# EasyEDA Pro project ProPrj_底板(最终版).epro

# Schematic Schematic1

## Sheets
1 P1: Assembly Variant: Basic; Board Name: Board1; Create Date: 2026-09-26; Page Name: P1; Project Name: 底板; Schematic Name: Schematic1; Update Date: 2026-09-26; Company: 嘉立创EDA; Page Size: A4; Version: V1.0
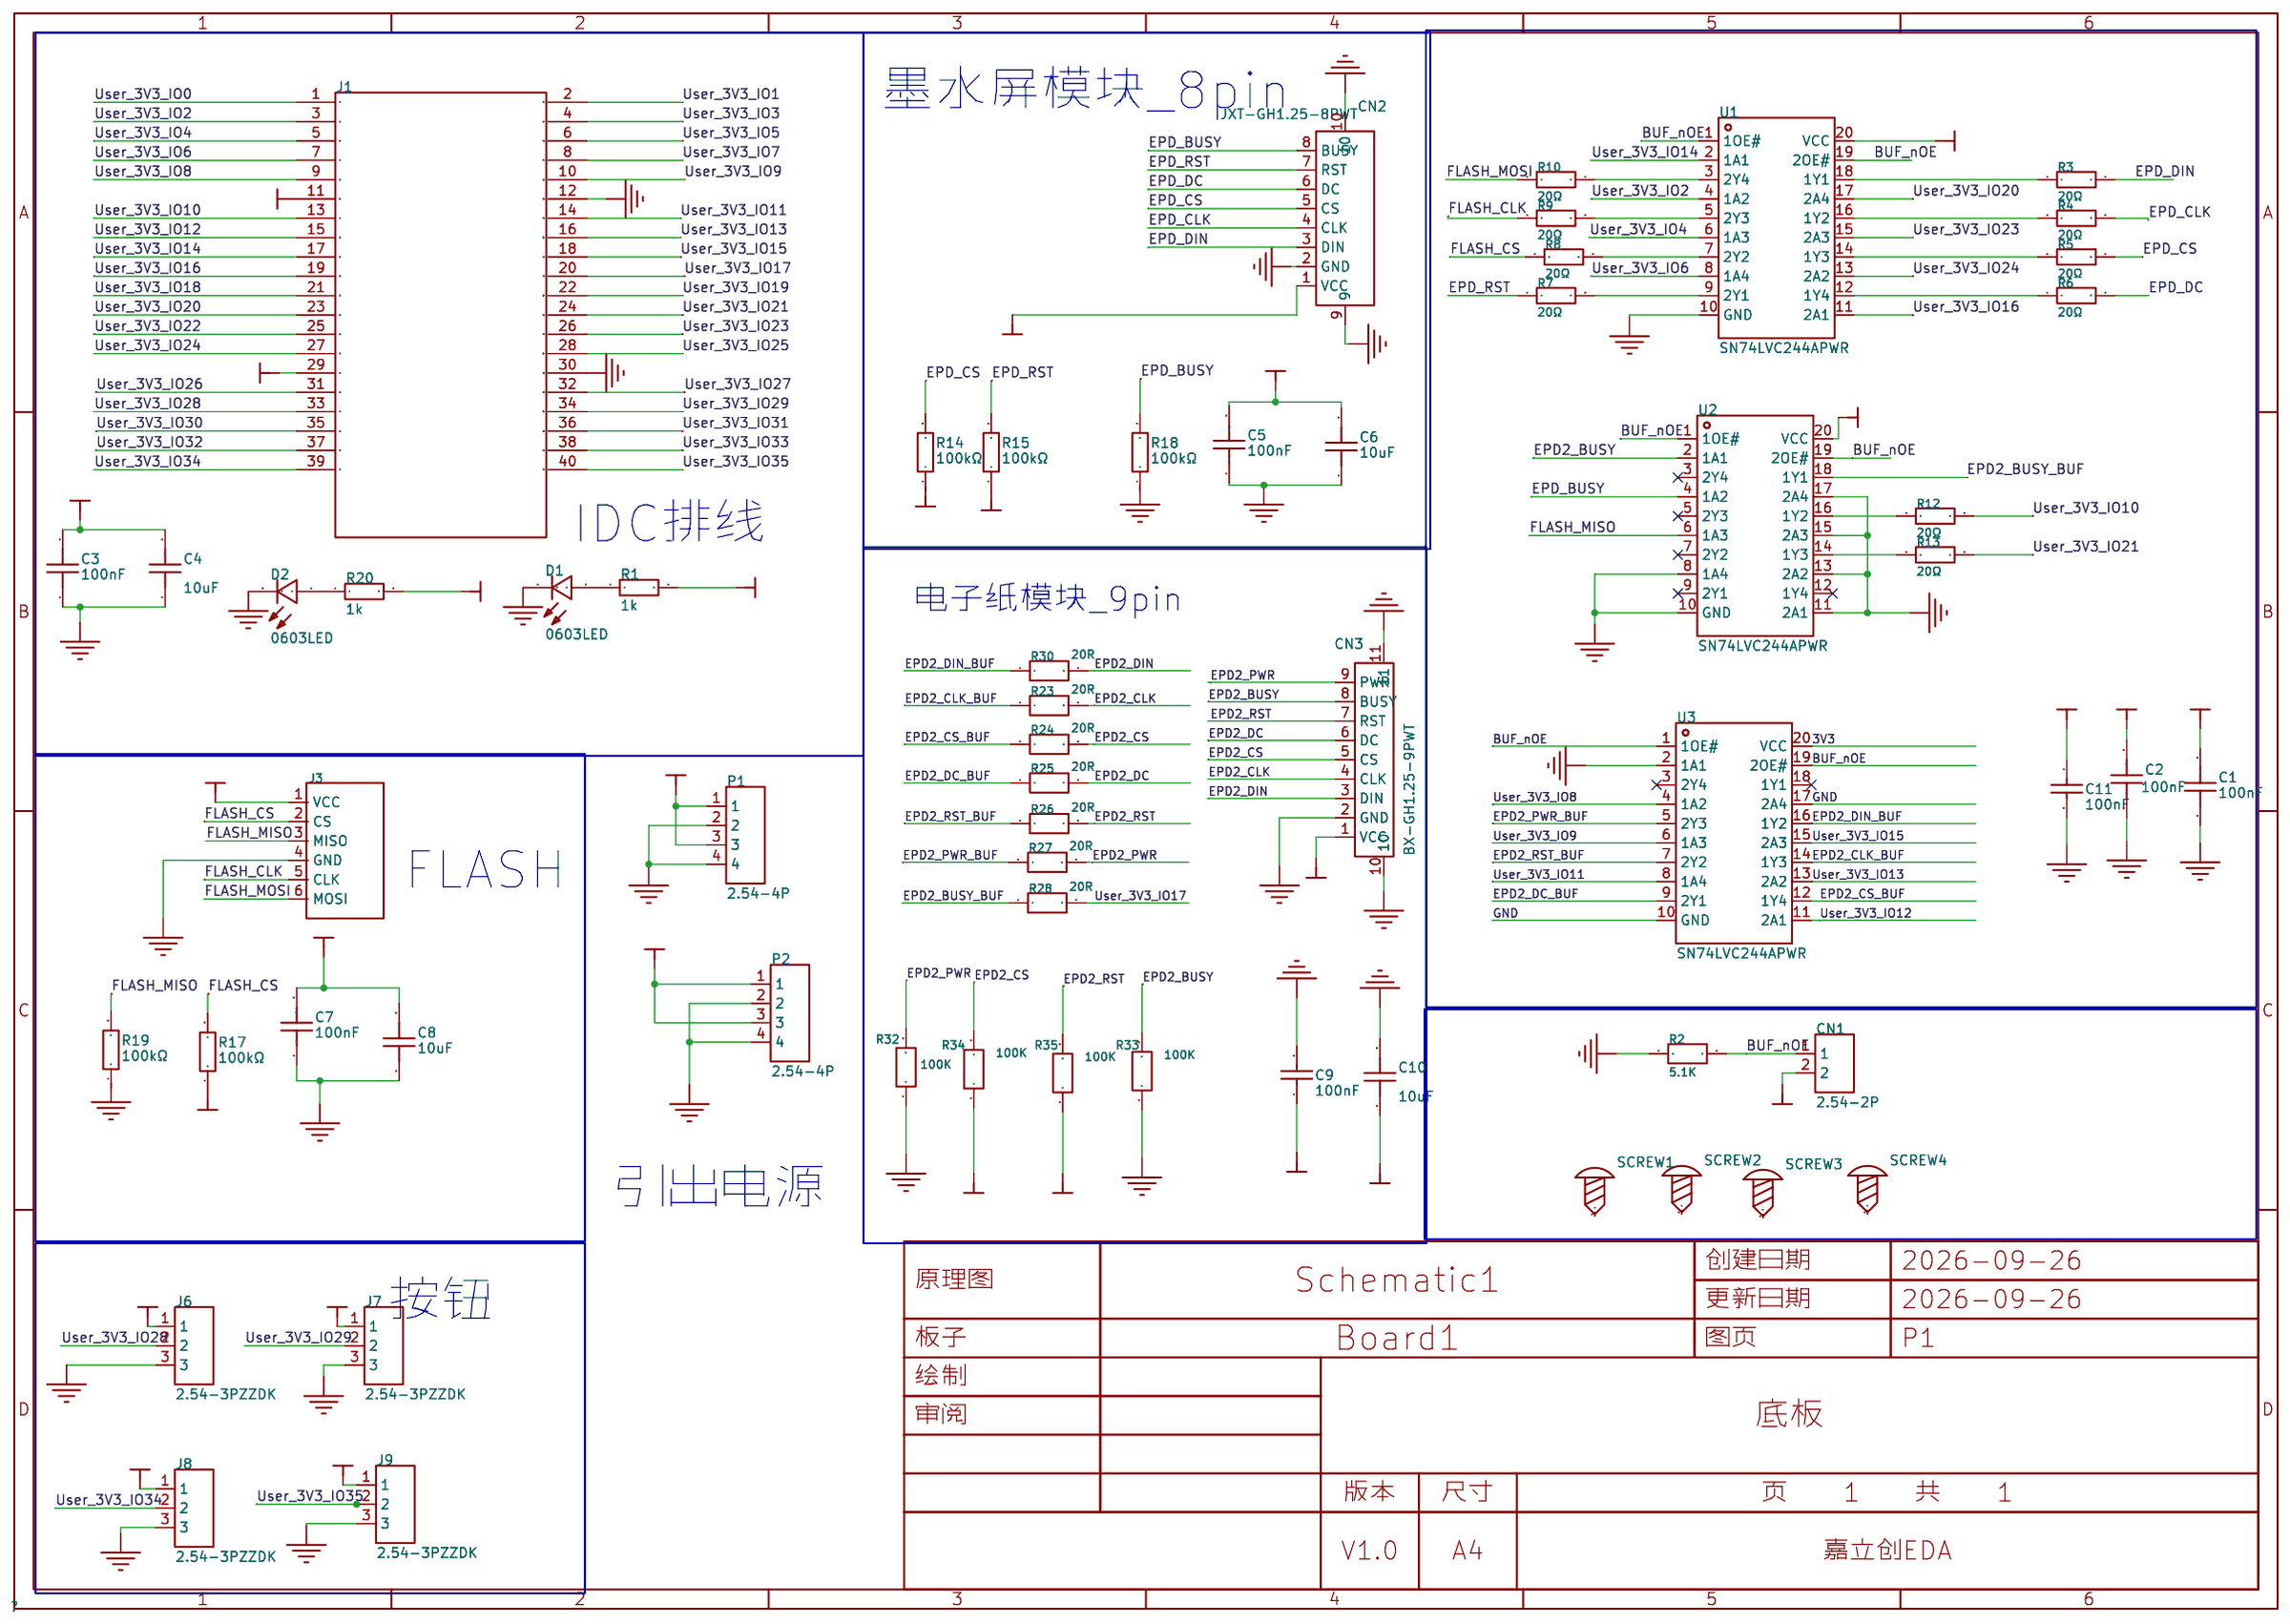
[diagram p0: P1]
2 P2: Create Date: 2026-10-08; Page Name: P2; Project Name: 底板(最终版); Update Date: 2026-10-08
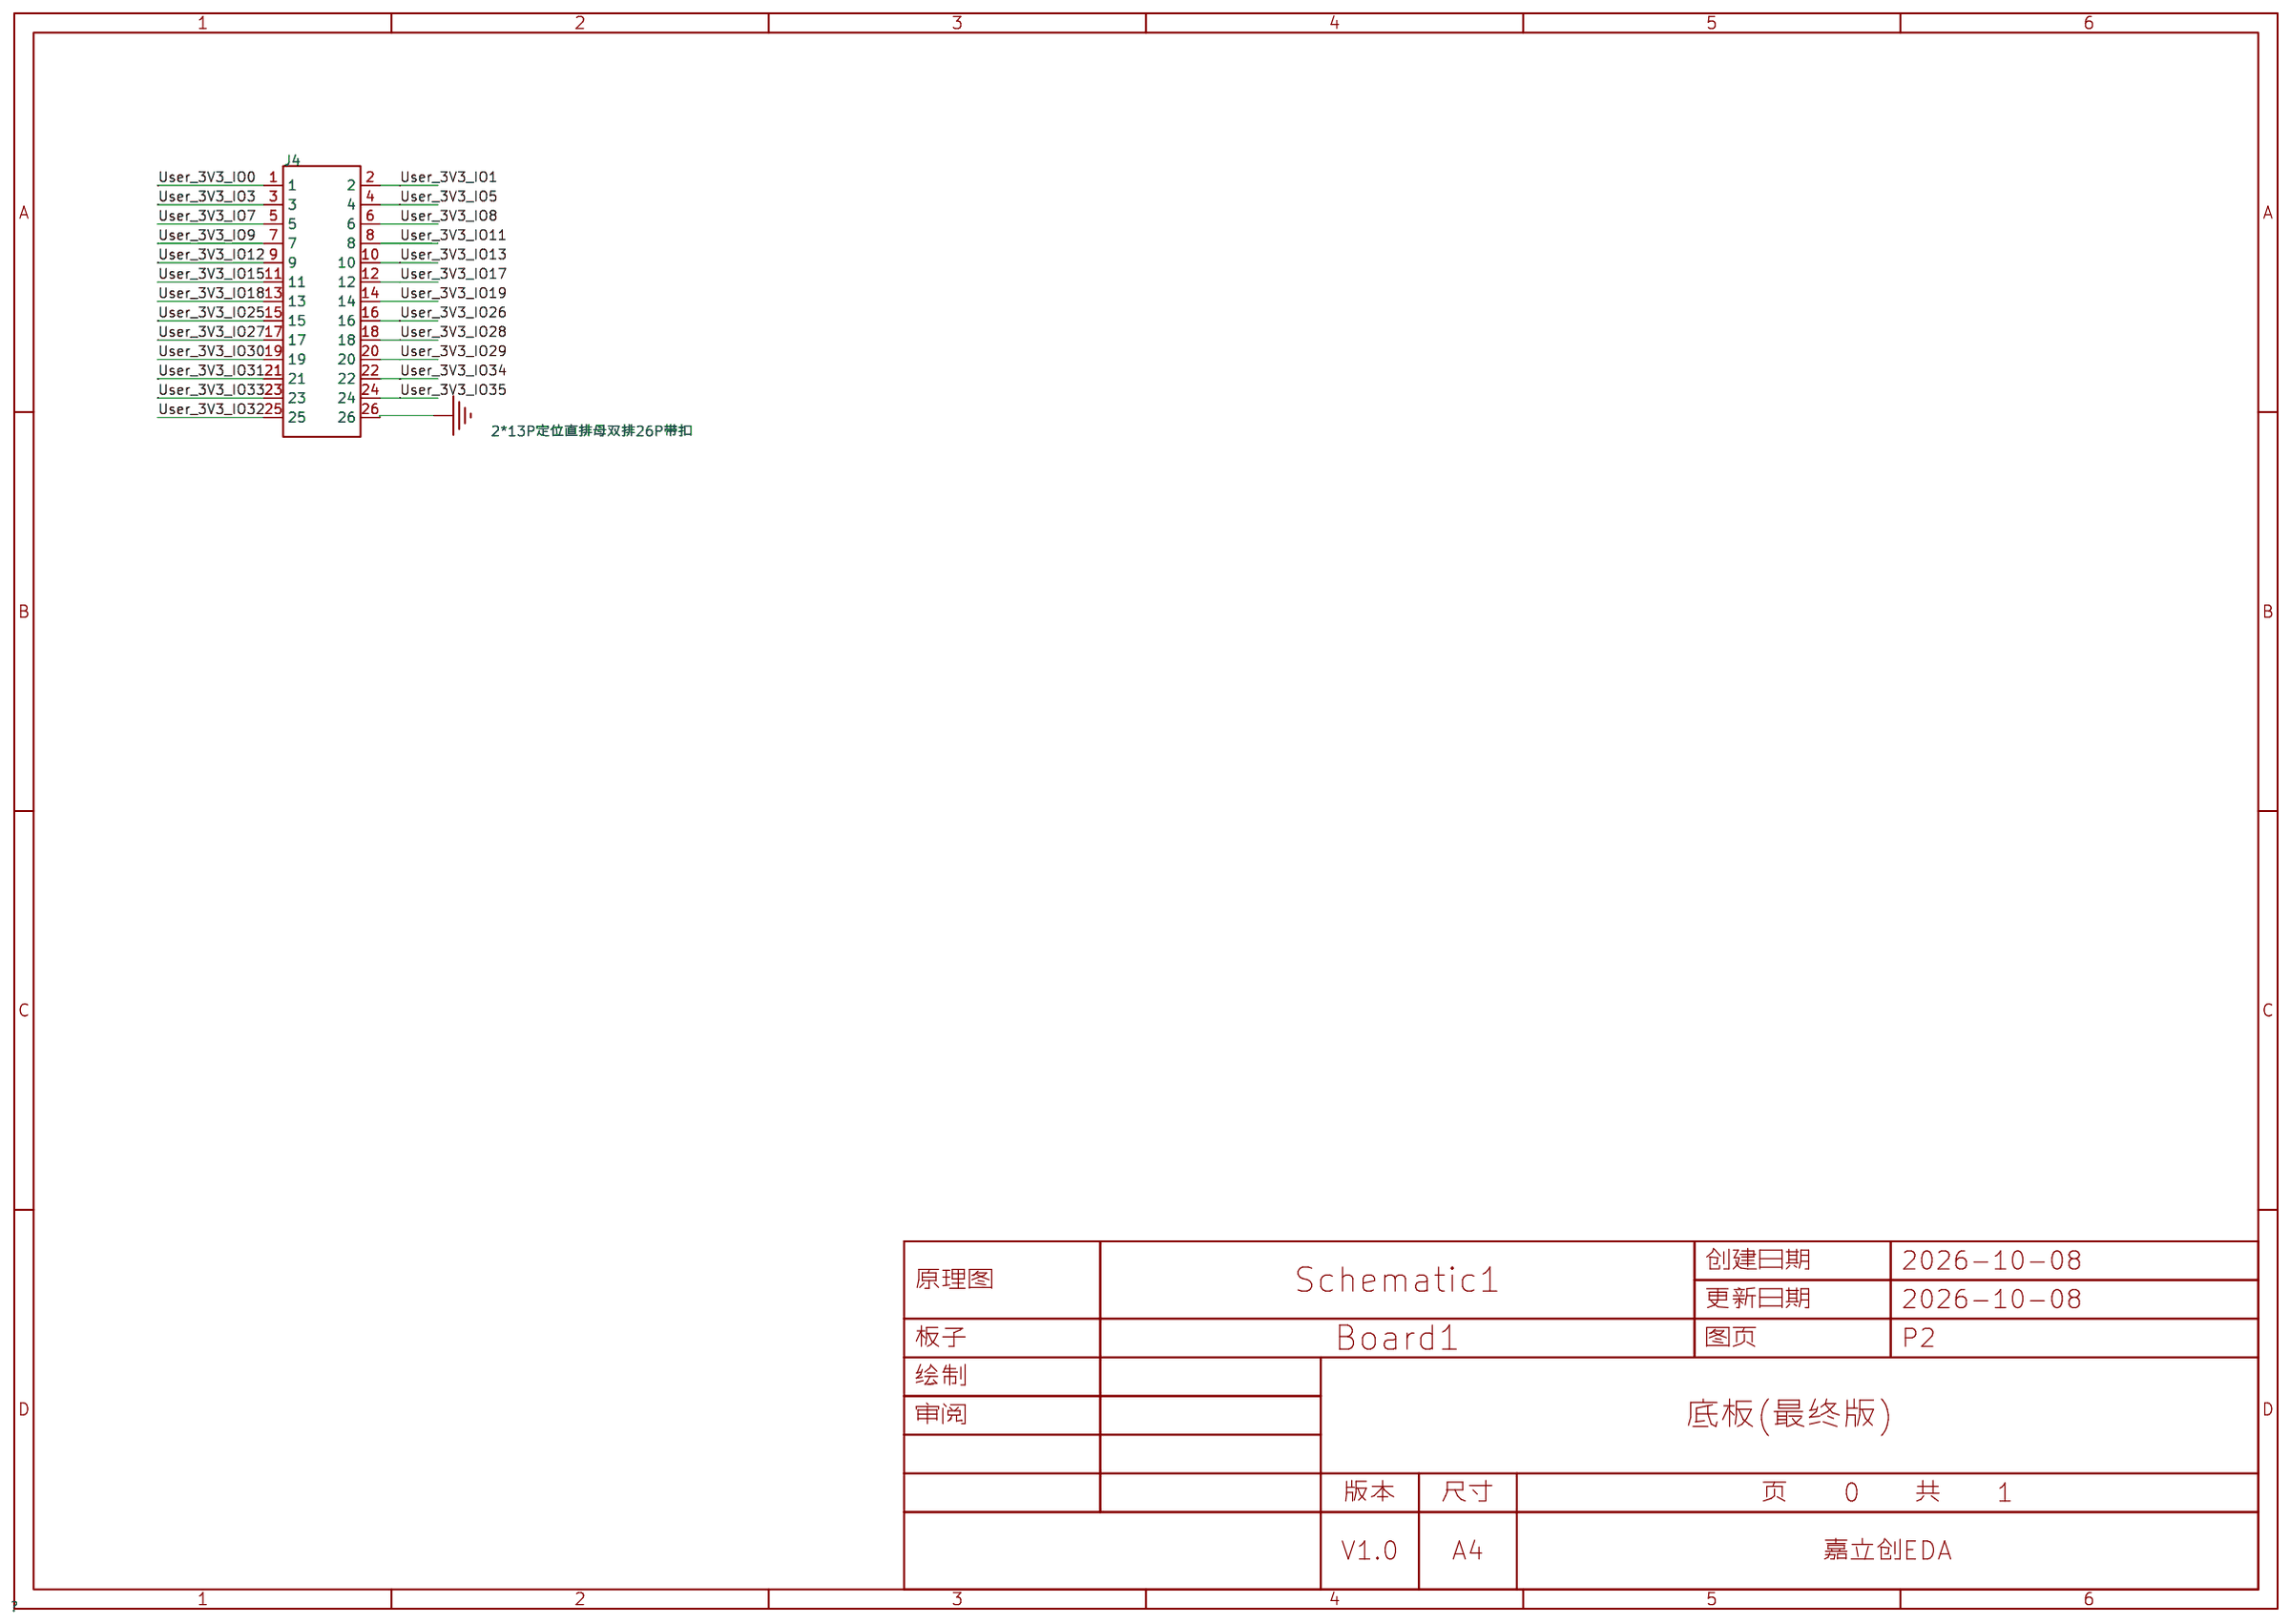
[diagram p1: P2]

## Parts
sheet P1
C1  100nF  [C0603]
C2  100nF  [C0603]
C3  100nF  [C0603]
C4  10uF  [C0805]
C5  100nF  [C0603]
C6  10uF  [C0805]
C7  100nF  [C0603]
C8  10uF  [C0805]
C9  100nF  [C0603]
C10  10uF  [C0805]
C11  100nF  [C0603]
CN1  2.54-2P  [CONN-TH_2P-P2.54_C9900022459]
CN2  JXT-GH1.25-8PWT  [CONN-SMD_8P-P1.25_JXT-GH1.25-8PWT]
CN3  BX-GH1.25-9PWT  [CONN-SMD_9P-P1.25_BX-GH1.25-9PWT]
D1  0603LED  [LED0603-R-RD_RED]
D2  0603LED  [LED0603-R-RD_RED]
J1  -  [IDC40P]
J3  X4611FV-06-C63D28  [HDR-TH_6P-P2.00-V-F]
J6  2.54-3PZZDK  [CONN-TH_3P-P2.50_2.54-3P-ZZDK]
J7  2.54-3PZZDK  [CONN-TH_3P-P2.50_2.54-3P-ZZDK]
J8  2.54-3PZZDK  [CONN-TH_3P-P2.50_2.54-3P-ZZDK]
J9  2.54-3PZZDK  [CONN-TH_3P-P2.50_2.54-3P-ZZDK]
P1  2.54-4P  [CONN-TH_B4B-XH-A-BK-LF-SN]
P2  2.54-4P  [CONN-TH_B4B-XH-A-BK-LF-SN]
R1  1k  [R0603]
R2  5.1K  [R0603]
R3  20Ω  [R0603]
R4  20Ω  [R0603]
R5  20Ω  [R0603]
R6  20Ω  [R0603]
R7  20Ω  [R0603]
R8  20Ω  [R0603]
R9  20Ω  [R0603]
R10  20Ω  [R0603]
R12  20Ω  [R0603]
R13  20Ω  [R0603]
R14  100kΩ  [R0603]
R15  100kΩ  [R0603]
R17  100kΩ  [R0603]
R18  100kΩ  [R0603]
R19  100kΩ  [R0603]
R20  1k  [R0603]
R23  20R  [R0603]
R24  20R  [R0603]
R25  20R  [R0603]
R26  20R  [R0603]
R27  20R  [R0603]
R28  20R  [R0603]
R30  20R  [R0603]
R32  100K  [R0603]
R33  100K  [R0603]
R34  100K  [R0603]
R35  100K  [R0603]
SCREW1  -  [M3螺丝]
SCREW2  -  [M3螺丝]
SCREW3  -  [M3螺丝]
SCREW4  -  [M3螺丝]
U1  SN74LVC244APWR  [TSSOP-20_L6.5-W4.4-P0.65-LS6.4-BL]
U2  SN74LVC244APWR  [TSSOP-20_L6.5-W4.4-P0.65-LS6.4-BL]
U3  SN74LVC244APWR  [TSSOP-20_L6.5-W4.4-P0.65-LS6.4-BL]
sheet P2
J4  2*13P定位直排母双排26P带扣  [IDC-TH_26P-P2.54-V-M-R2-C13-S2.54]

## Library data of the parts
C1-C3 C5 C7 = CC0603KRX7R9BB104: 容值:100nF;精度:±10%;额定电压:50V;温度系数:X7R;; LCSC Part Name: 100nF ±10% 50V; Supplier Part: C14663; Manufacturer: YAGEO(国巨); Supplier Footprint: 0603; JLCPCB Part Class: Basic Part; Datasheet: https://item.szlcsc.com/datasheet/CC0603KRX7R9BB104/15331.html; Supplier: LCSC; Tolerance: ±10%; Voltage Rating: 50V; Temperature Coefficient: X7R
C4 C6 C8 C10 = GRM21BR61H106KE43L: 容值:10uF;精度:±10%;额定电压:50V;温度系数:X5R;; LCSC Part Name: 10uF ±10% 50V; Supplier Part: C440198; Manufacturer: muRata(村田); Supplier Footprint: 0805; JLCPCB Part Class: Basic Part; Datasheet: https://item.szlcsc.com/datasheet/GRM21BR61H106KE43L/439567.html; Supplier: LCSC; Tolerance: ±10%; Voltage Rating: 50V; Temperature Coefficient: X5R
C9 C11 = CC0603KRX7R9BB104: 100nF 0603; Supplier Part: C14663; Manufacturer: YAGEO; Supplier Footprint: 0603; JLCPCB Part Class: Basic Part; Datasheet: https://www.lcsc.com/product-detail/C14663.html; Supplier: LCSC; Tolerance: ±10%; Voltage Rating: 50V; Temperature Coefficient: X7R
CN1 = 2.54-2P: Supplier Part: C9900022459; Supplier Footprint: CONN-TH_2P-P2.54; JLCPCB Part Class: Extended Part; Supplier: LCSC
CN2 = JXT-GH1.25-8PWT: 插针结构:1x8P;间距:1.25mm;安装方式:卧贴;参考系列:GH;总PIN数:8P;排数:1;每排PIN数:8;行距:-;额定电流:1A;触头材质:黄铜;触头镀层:锡;工作温度:-40℃~+85℃;; LCSC Part Name: 1x8P 间距:1.25mm 卧贴 系列:GH; Supplier Part: C52204930; Manufacturer: JXTCONN(聚兴泰); Supplier Footprint: SMD,P=1.25mm,卧贴; JLCPCB Part Class: Extended Part; Datasheet: https://item.szlcsc.com/datasheet/JXT-GH1.25-8PWT/55046886.html; Supplier: LCSC; Pins Structure: 1x8P; Pitch: 1.25mm; Mounting Type: 卧贴; Reference Series: GH; Number of Pins: 8P; Number of Rows: 1; Number of PINs Per Row: 8; Current Rating: 1A; Contact Material: 黄铜; Contact Plating: 锡; Operating Temperature: -40℃~+85℃; Voltage Rating: 50V; Plastic Material: LCP; Flame Retardant Rating: UL94V-0; Supplementary Features: 辅助焊脚; Color: 米色; Z-Height of the Board: 4.25mm; X-Length of Bottom Edge on Board (Spacing Line): 13.25mm; Y-Width of Bottom Edge on Board: 4.05mm
CN3 = BX-GH1.25-9PWT: 插针结构:1x9P;间距:1.25mm;安装方式:卧贴;参考系列:GH;总PIN数:9P;排数:1;每排PIN数:9;行距:-;额定电流:1A;触头材质:磷铜;触头镀层:锡;工作温度:-25℃~+85℃;; LCSC Part Name: 1x9P 间距:1.25mm 卧贴 系列:GH; Supplier Part: C18077725; Manufacturer: Bossie(博锡); Supplier Footprint: SMD,P=1.25mm,卧贴; JLCPCB Part Class: Extended Part; Datasheet: https://item.szlcsc.com/datasheet/BX-GH1.25-9PWT/19218126.html; Supplier: LCSC; Pins Structure: 1x9P; Pitch: 1.25mm; Mounting Type: 卧贴; Reference Series: GH; Number of Pins: 9P; Number of Rows: 1; Number of PINs Per Row: 9; Current Rating: 1A; Contact Material: 磷铜; Contact Plating: 锡; Operating Temperature: -25℃~+85℃; Voltage Rating: 125V; Plastic Material: LCP; Supplementary Features: 辅助焊脚; Color: 米色; Z-Height of the Board: 4.35mm; X-Length of Bottom Edge on Board (Spacing Line): 14.5mm; Y-Width of Bottom Edge on Board: 5mm
D1 D2 = 0603LED: Supplier Part: C9900009051; Supplier Footprint: LED-RED-0603; JLCPCB Part Class: Extended Part; Supplier: LCSC
J1 = iDC40P
J3 = X4611FV-06-C63D28: LCSC Part Name: 2.0mm 排母,单排,180度,塑高6.3mm,塑宽2.4mm,下针D2.8mm,U型,6T料,镀金,06P; Supplier Part: C56147503; Manufacturer: XKB Connection(中国星坤); Supplier Footprint: 插件,P=2mm; JLCPCB Part Class: Extended Part; Datasheet: https://item.szlcsc.com/datasheet/X4611FV-06-C63D28/60366544.html; Supplier: LCSC
J6-J9 = 2.54-3PZZDK: Supplier Part: C9900106386; Supplier Footprint: TH-3P; JLCPCB Part Class: Extended Part; Supplier: LCSC
P1 P2 = 2.54-4P: Supplier Part: C9900013241; Supplier Footprint: CONN-TH; JLCPCB Part Class: Extended Part; Supplier: LCSC
R1 R20 = 0603WAF3301T5E: 电阻类型:厚膜电阻;阻值:3.3kΩ;精度:±1%;功率:100mW;工作电压:75V;温度系数:±100ppm/℃;; LCSC Part Name: 3.3kΩ ±1% 100mW 厚膜电阻; Supplier Part: C22978; Manufacturer: UNI-ROYAL(厚声); Supplier Footprint: 0603; JLCPCB Part Class: Basic Part; Datasheet: https://item.szlcsc.com/datasheet/0603WAF3301T5E/23705.html; Supplier: LCSC; Type: 厚膜电阻; Tolerance: ±1%; Power(Watts): 100mW; Voltage-Supply(Max): 75V; Temperature Coefficient: ±100ppm/℃; Operating Temperature: -55℃~+155℃
R2 = FRQ0603F1302TS: 电阻类型:厚膜电阻;阻值:13kΩ;精度:±1%;功率:100mW;工作电压:75V;温度系数:±100ppm/℃;; LCSC Part Name: 厚膜电阻 13kΩ ±1% 100mW; Supplier Part: C42372214; Manufacturer: FOJAN(富捷); Supplier Footprint: 0603; Datasheet: https://item.szlcsc.com/datasheet/FRQ0603F1302TS/44254394.html; Supplier: LCSC; Type: 厚膜电阻; Tolerance: ±1%; Power(Watts): 100mW; Voltage-Supply(Max): 75V; Temperature Coefficient: ±100ppm/℃; Operating Temperature: -55℃~+155℃
R3-R10 R12 R13 = 0603WAF200JT5E: 电阻类型:厚膜电阻;阻值:20Ω;精度:±1%;功率:100mW;最大工作电压:75V;温度系数:±100ppm/℃;; LCSC Part Name: 20Ω ±1% 100mW 厚膜电阻; Supplier Part: C22950; Manufacturer: UNI-ROYAL(厚声); Supplier Footprint: 0603; JLCPCB Part Class: Basic Part; Datasheet: https://atta.szlcsc.com/upload/public/pdf/source/20200306/C422600_1E6D84923E4A46A82E41ADD87F860B5C.pdf; Supplier: LCSC; Type: 厚膜电阻; Tolerance: ±1%; Power(Watts): 100mW; Overload Voltage (Max): 75V; Temperature Coefficient: ±100ppm/℃; Operating Temperature Range: -55℃~+155℃
R14 R15 R17-R19 = 0603WAF1003T5E: 电阻类型:厚膜电阻;阻值:100kΩ;精度:±1%;功率:100mW;工作电压:75V;温度系数:±100ppm/℃;; LCSC Part Name: 厚膜电阻 100kΩ ±1%; Supplier Part: C25803; Manufacturer: UNI-ROYAL(厚声); Supplier Footprint: 0603; JLCPCB Part Class: Basic Part; Datasheet: https://item.szlcsc.com/datasheet/0603WAF1003T5E/26546.html; Supplier: LCSC; Type: 厚膜电阻; Tolerance: ±1%; Power(Watts): 100mW; Voltage-Supply(Max): 75V; Temperature Coefficient: ±100ppm/℃; Operating Temperature: -55℃~+155℃
R23-R28 R30 = 0603WAF200JT5E: 20R 0603; Supplier Part: C22950; Manufacturer: UNI-ROYAL; Supplier Footprint: 0603; Datasheet: https://www.lcsc.com/product-detail/C22950.html; Supplier: LCSC; Type: 厚膜电阻; Tolerance: ±1%; Power(Watts): 100mW; Voltage-Supply(Max): 75V; Temperature Coefficient: ±100ppm/℃; Operating Temperature: -55℃~+155℃; Resistance: 20Ω
R32-R35 = 0603WAF1003T5E: 100K 0603; Supplier Part: C25803; Manufacturer: UNI-ROYAL; Supplier Footprint: 0603; Datasheet: https://www.lcsc.com/product-detail/C25803.html; Supplier: LCSC; Type: 厚膜电阻; Tolerance: ±1%; Power(Watts): 100mW; Voltage-Supply(Max): 75V; Temperature Coefficient: ±100ppm/℃; Operating Temperature: -55℃~+155℃; Resistance: 100kΩ
SCREW1-SCREW4 = M3螺丝: Supplier Footprint: 插件
U1-U3 = SN74LVC244APWR: 输入类型:-;工作电压:1.65V~3.6V;元件数:2;每个元件位数:4;灌电流(IOL):24mA;拉电流(IOH):24mA;; LCSC Part Name: 三态输出，八路缓冲器/驱动器; Supplier Part: C7668; Manufacturer: TI(德州仪器); Supplier Footprint: TSSOP-20; JLCPCB Part Class: Extended Part; Datasheet: https://www.ti.com/cn/lit/ds/symlink/sn74lvc244a.pdf; Supplier: LCSC; output type: 三态; Voltage - Supply: 1.65V~3.6V; Number of Elements: 2; Number of Bits per Element: 4; Channel Type: 单向; Current - Output Low(IOL): 24mA; Current - Output High(IOH): 24mA; Logic Family: 74LVC; Operating Temperature: -40℃~+125℃; Quiescent Current: 40uA; Propagation Delay: 3.9ns@3.3V,50pF; Features: 掉电隔离；输出使能；电平转换
J4 = 2*13P定位直排母双排26P带扣: Supplier Part: C9900004837; Supplier Footprint: 插件; JLCPCB Part Class: Extended Part; Supplier: LCSC

## Nets
3V3: C1.2 C2.2 C3.2 C4.2 C5.2 C6.2 C7.2 C8.2 C9.1 C10.1 C11.1 CN1.2 CN2.1(VCC) CN3.1(VCC) J1.29(15) J3.1(VCC) J6.1 J7.1 J8.1 J9.1 P1.1 P1.3 R1.2 R14.1 R15.1 R17.1 R34.1 R35.1 U1.20(VCC) U2.20(VCC) U3.20(VCC)
5V: J1.11(6) P2.1 P2.3 R20.2
GND: C1.1 C2.1 C3.1 C4.1 C5.1 C6.1 C7.1 C8.1 C9.2 C10.2 C11.2 CN2.2(GND) CN2.9 CN2.10 CN3.2(GND) CN3.10 CN3.11 D1.2(C) D2.2(C) J1.12(26) J1.30(35) J3.4(GND) J4.26 J6.3 J7.3 J8.3 J9.3 P1.2 P1.4 P2.2 P2.4 R2.1 R18.1 R19.1 R32.1 R33.1 U1.10(GND) U2.8(1A4) U2.10(GND) U2.11(2A1) U2.13(2A2) U2.15(2A3) U2.17(2A4) U3.2(1A1) U3.10(GND) U3.17(2A4)
BUF_nOE: CN1.1 R2.2 U1.1(1OE#) U1.19(2OE#) U2.1(1OE#) U2.19(2OE#) U3.1(1OE#) U3.19(2OE#)
EPD2_BUSY: CN3.8(BUSY) R33.2 U2.2(1A1)
EPD2_BUSY_BUF: R28.1 U2.18(1Y1)
EPD2_CLK: CN3.4(CLK) R23.2
EPD2_CLK_BUF: R23.1 U3.14(1Y3)
EPD2_CS: CN3.5(CS) R24.2 R34.2
EPD2_CS_BUF: R24.1 U3.12(1Y4)
EPD2_DC: CN3.6(DC) R25.2
EPD2_DC_BUF: R25.1 U3.9(2Y1)
EPD2_DIN: CN3.3(DIN) R30.2
EPD2_DIN_BUF: R30.1 U3.16(1Y2)
EPD2_PWR: CN3.9(PWR) R27.2 R32.2
EPD2_PWR_BUF: R27.1 U3.5(2Y3)
EPD2_RST: CN3.7(RST) R26.2 R35.2
EPD2_RST_BUF: R26.1 U3.7(2Y2)
EPD_BUSY: CN2.8(BUSY) R18.2 U2.4(1A2)
EPD_CLK: CN2.4(CLK) R4.2
EPD_CS: CN2.5(CS) R5.2 R14.2
EPD_DC: CN2.6(DC) R6.2
EPD_DIN: CN2.3(DIN) R3.2
EPD_RST: CN2.7(RST) R7.1 R15.2
FLASH_CLK: J3.5(CLK) R9.1
FLASH_CS: J3.2(CS) R8.1 R17.2
FLASH_MISO: J3.3(MISO) R19.2 U2.6(1A3)
FLASH_MOSI: J3.6(MOSI) R10.1
User_3V3_IO0: J1.1 J4.1
User_3V3_IO1: J1.2(21) J4.2
User_3V3_IO2: J1.3(2) U1.4(1A2)
User_3V3_IO3: J1.4(22) J4.3
User_3V3_IO4: J1.5(3) U1.6(1A3)
User_3V3_IO5: J1.6(23) J4.4
User_3V3_IO6: J1.7(4) U1.8(1A4)
User_3V3_IO7: J1.8(24) J4.5
User_3V3_IO8: J1.9(5) J4.6 U3.4(1A2)
User_3V3_IO9: J1.10(25) J4.7 U3.6(1A3)
User_3V3_IO10: J1.13(7) R12.2
User_3V3_IO11: J1.14(27) J4.8 U3.8(1A4)
User_3V3_IO12: J1.15(8) J4.9 U3.11(2A1)
User_3V3_IO13: J1.16(28) J4.10 U3.13(2A2)
User_3V3_IO14: J1.17(9) U1.2(1A1)
User_3V3_IO15: J1.18(29) J4.11 U3.15(2A3)
User_3V3_IO16: J1.19(10) U1.11(2A1)
User_3V3_IO17: J1.20(30) J4.12 R28.2
User_3V3_IO18: J1.21(11) J4.13
User_3V3_IO19: J1.22(31) J4.14
User_3V3_IO20: J1.23(12) U1.17(2A4)
User_3V3_IO21: J1.24(32) R13.2
User_3V3_IO22: J1.25(13)
User_3V3_IO23: J1.26(33) U1.15(2A3)
User_3V3_IO24: J1.27(14) U1.13(2A2)
User_3V3_IO25: J1.28(34) J4.15
User_3V3_IO26: J1.31(16) J4.16
User_3V3_IO27: J1.32(36) J4.17
User_3V3_IO28: J1.33(17) J4.18 J6.2
User_3V3_IO29: J1.34(37) J4.20 J7.2
User_3V3_IO30: J1.35(18) J4.19
User_3V3_IO31: J1.36(38) J4.21
User_3V3_IO32: J1.37(19) J4.25
User_3V3_IO33: J1.38(39) J4.23
User_3V3_IO34: J1.39(20) J4.22 J8.2
User_3V3_IO35: J1.40 J4.24 J9.2
$1N39: D1.1(A) R1.1
$1N100: R3.1 U1.18(1Y1)
$1N110: R12.1 U2.16(1Y2)
$1N121: R13.1 U2.14(1Y3)
$1N153: R9.2 U1.5(2Y3)
$1N155: R5.1 U1.14(1Y3)
$1N157: R6.1 U1.12(1Y4)
$1N159: R4.1 U1.16(1Y2)
$1N162: R7.2 U1.9(2Y1)
$1N164: R8.2 U1.7(2Y2)
$1N165: R10.2 U1.3(2Y4)
$1N253: D2.1(A) R20.1

Not connected (* = marked no-connect by the designer): SCREW1 1; SCREW2 1; SCREW3 1; SCREW4 1; U2 3(2Y4)* 5(2Y3)* 7(2Y2)* 9(2Y1)* 12(1Y4)*; U3 3(2Y4)* 18(1Y1)*

## Notes on the sheets
sheet 1
- 墨水屏模块_8pin
- IDC排线
- 电子纸模块_9pin
- FLASH
- 引出电源
- 按钮

# Board PCB1
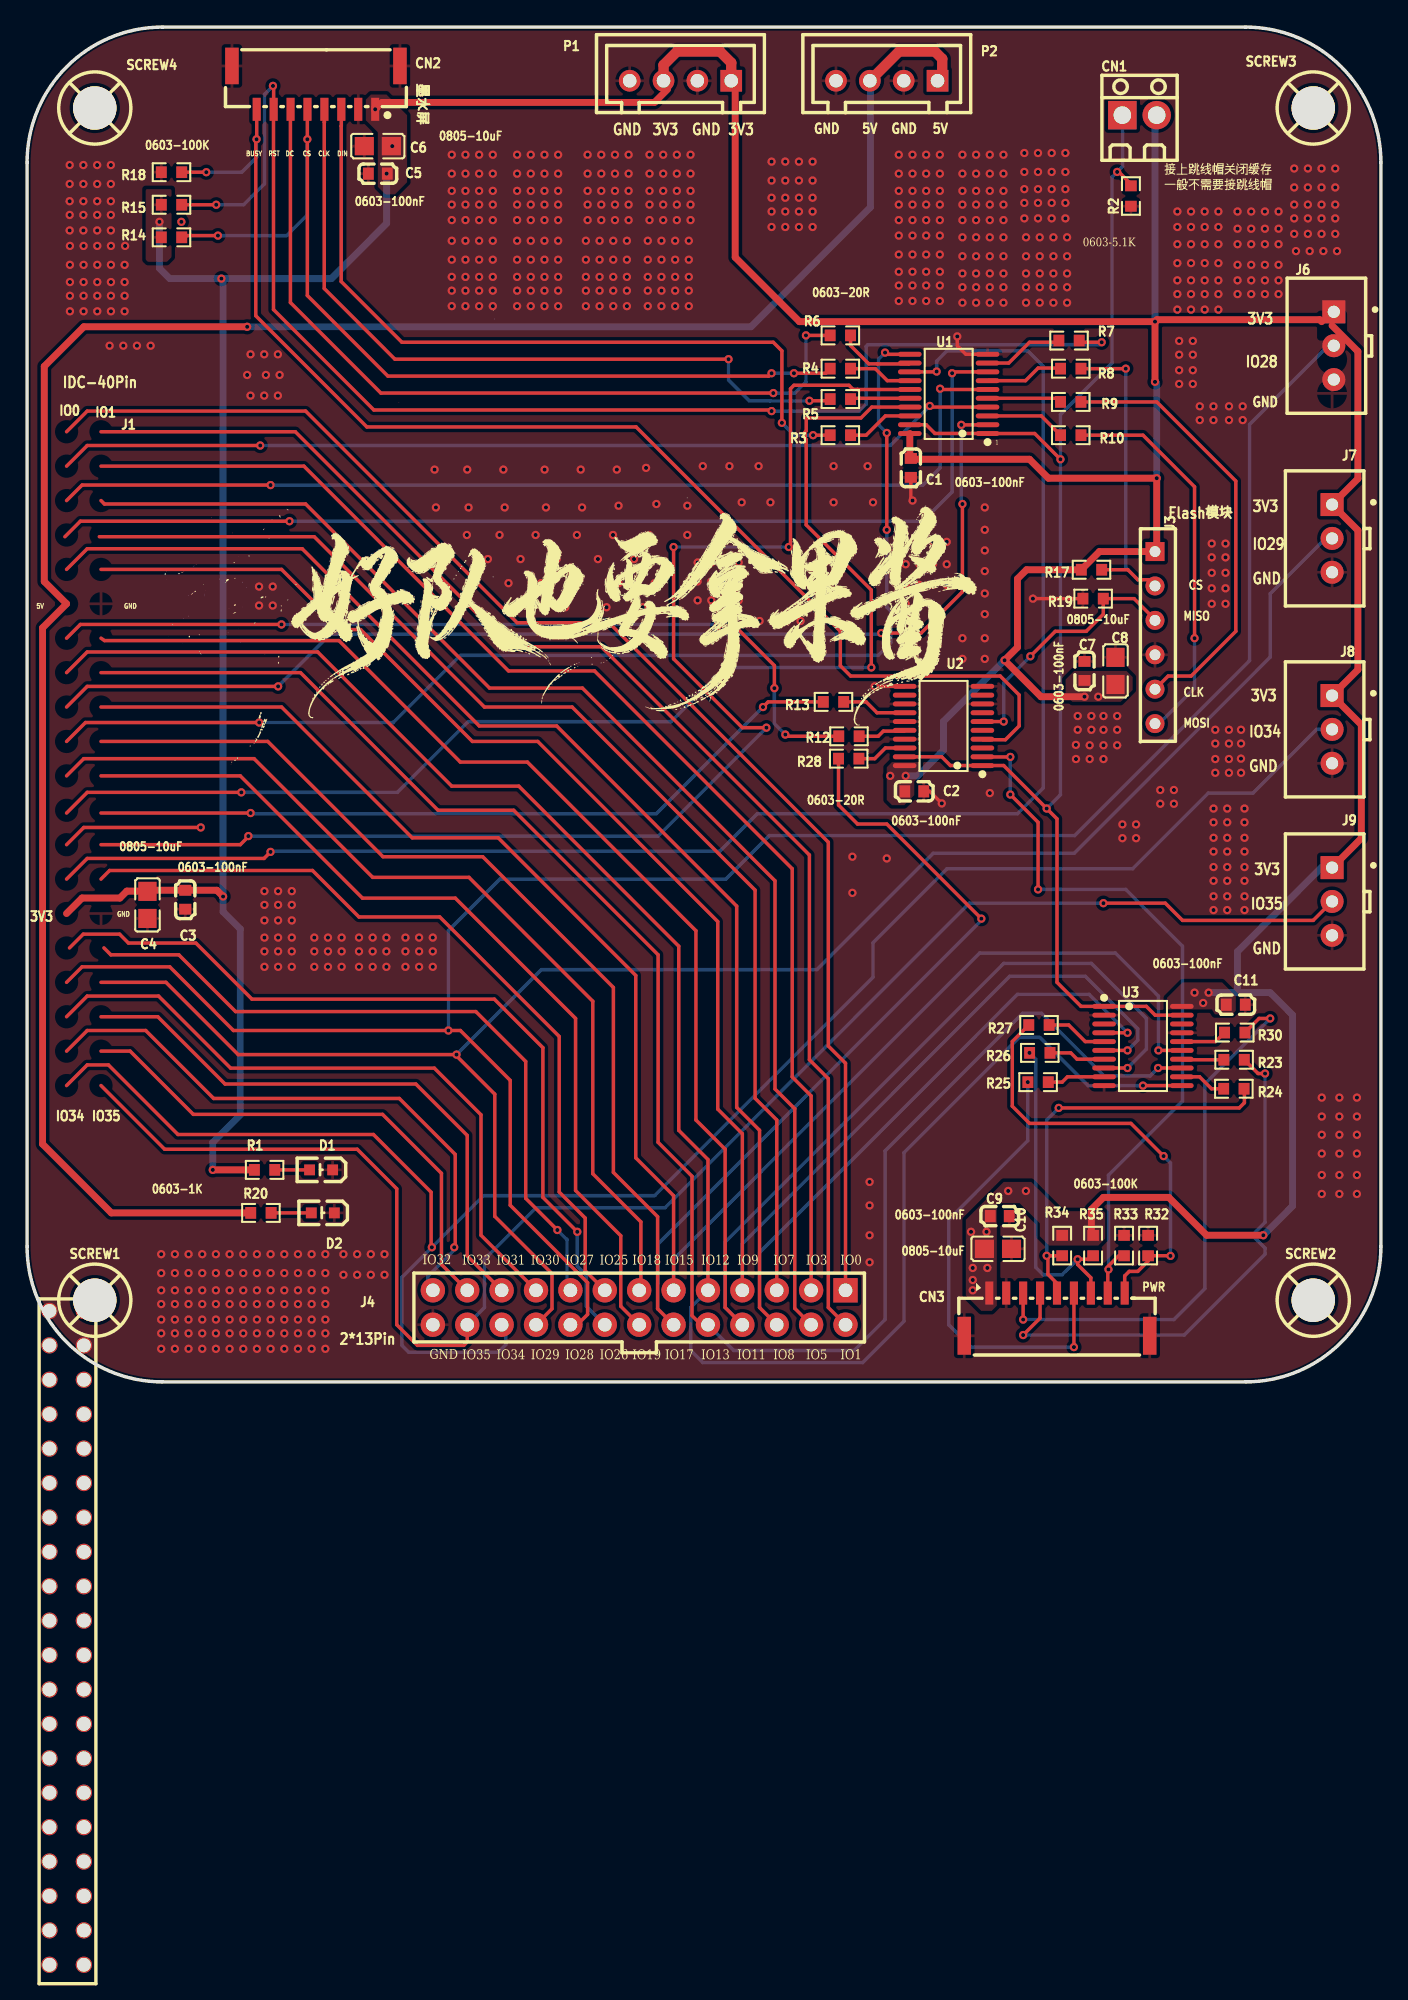
[diagram p2: board, top side]
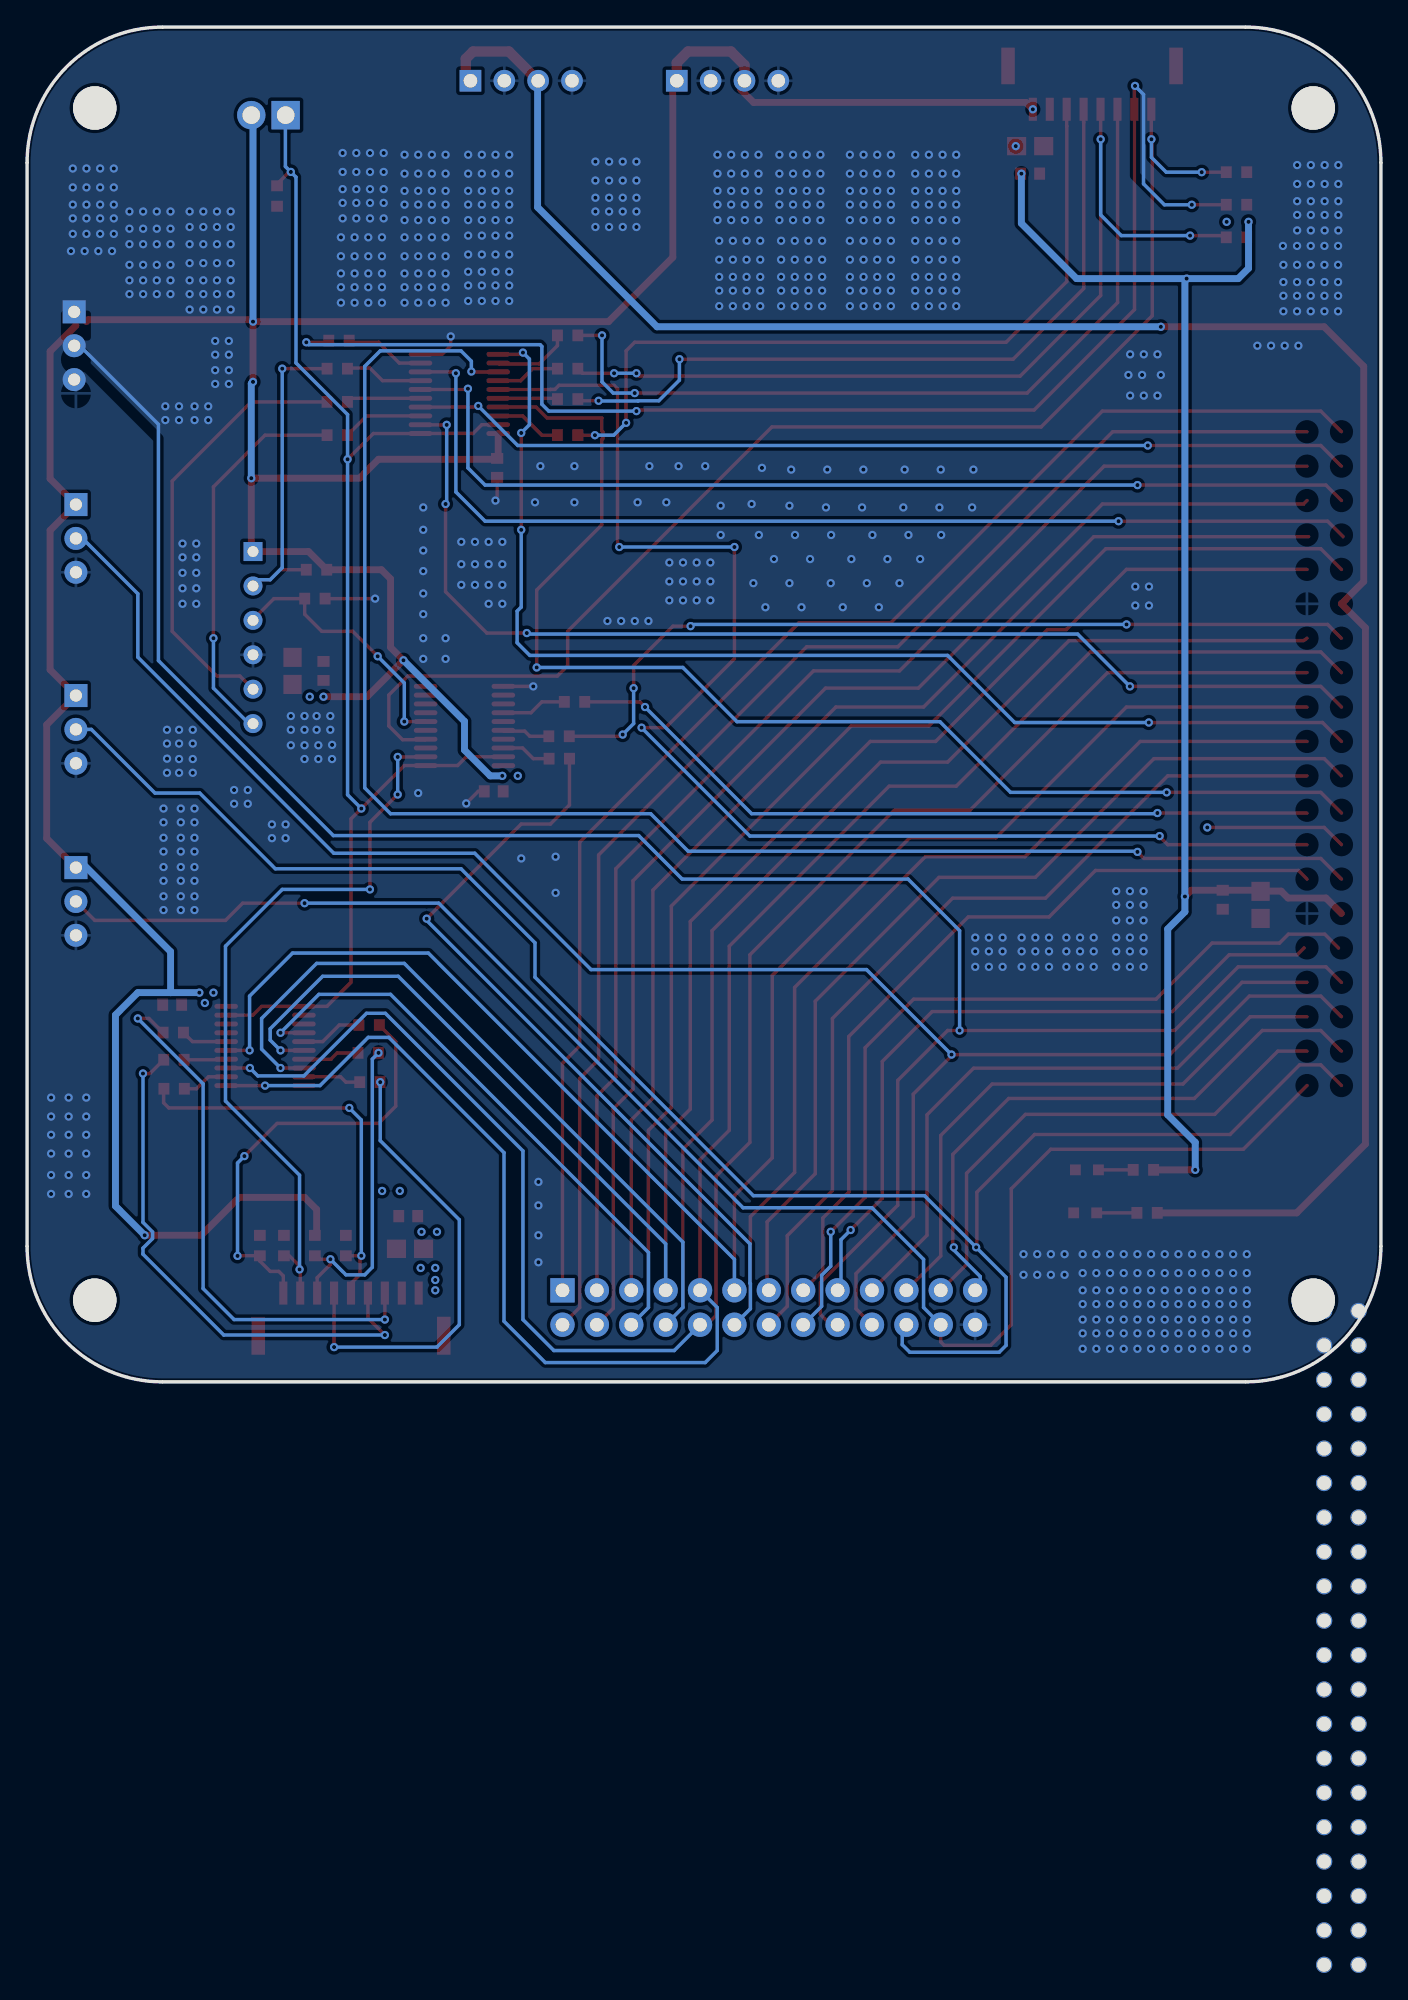
[diagram p3: board, bottom side, seen from below]

Outline 100 x 100 mm; copper layers: Top Layer, Bottom Layer. Coordinates in mm from the lower left corner of the outline.
Outline path: 0,90 0,10 arc(2.93,2.93) 10,0 90,0 arc(97.07,2.93) 100,10 100,90 arc(97.07,97.07) 90,100 10,100 arc(2.93,97.07) 0,90
Stack: Top Layer 0.035mm / Dielectric1 1.51mm FR4 er 4.5 / Bottom Layer 0.035mm

## Design rules (mm)
spacing copperThickness1oz (default): track to track 0.102, other pairs 0.152 to 0.3
spacing copperThickness2oz: track to track 0.203, other pairs 0.152 to 0.3
spacing Plane_innerPlane: track to track 0.102, other pairs 0.152 to 0.3
spacing Copper_copperRegion: track to track 0.102, other pairs 0.152 to 0.3
track width copperThickness1oz (default): min 0.127, default 0.254, max 2.54
track width copperThickness2oz: min 0.203, default 0.254, max 2.54
track width power: min 0.127, default 0.508, max 2.54
differential pair differentialPair (default): width min 0.127, default 0.254, max 2.54; gap min 0.152, default 0.152
net 3V3 uses copperRegion_copperThickness1oz, power
net 5V uses power
net GND uses copperRegion_copperThickness1oz
pour e1828 uses Copper_copperRegion, copperRegion_Copper_copperRegion
pour e1880 uses Copper_copperRegion, copperRegion_Copper_copperRegion
pour e2116 uses Copper_copperRegion, copperRegion_Copper_copperRegion

## Placement (name value [footprint] x y rotation side)
C1  100nF  [C0603]  65.28 67.46 90 top
C2  100nF  [C0603]  65.53 43.59 180 top
C3  100nF  [C0603]  11.68 35.59 90 top
C4  10uF  [C0805]  8.89 35.21 90 top
C5  100nF  [C0603]  25.91 89.18 0 top
C6  10uF  [C0805]  25.91 91.21 0 top
C7  100nF  [C0603]  78.11 52.48 270 top
C8  10uF  [C0805]  80.39 52.48 270 top
C9  100nF  [C0603]  71.85 12.23 0 top
C10  10uF  [C0805]  71.72 9.82 0 top
C11  100nF  [C0603]  89.28 27.84 0 top
CN1  2.54-2P  [CONN-TH_2P-P2.54_C9900022459]  82.17 93.5 0 top
CN2  JXT-GH1.25-8PWT  [CONN-SMD_8P-P1.25_JXT-GH1.25-8PWT]  21.34 95.53 180 top
CN3  BX-GH1.25-9PWT  [CONN-SMD_9P-P1.25_BX-GH1.25-9PWT]  76.07 4.98 0 top
D1  0603LED  [LED0603-R-RD_RED]  21.72 15.65 180 top
D2  0603LED  [LED0603-R-RD_RED]  21.84 12.47 180 top
J1  -  [IDC40P]  1.65 47.27 270 top
J3  X4611FV-06-C63D28  [HDR-TH_6P-P2.00-V-F]  83.31 56.29 270 top
J4  2*13P定位直排母双排26P带扣  [IDC-TH_26P-P2.54-V-M-R2-C13-S2.54]  45.21 5.49 0 top
J6  2.54-3PZZDK  [CONN-TH_3P-P2.50_2.54-3P-ZZDK]  96.52 76.48 270 top
J7  2.54-3PZZDK  [CONN-TH_3P-P2.50_2.54-3P-ZZDK]  96.39 62.26 270 top
J8  2.54-3PZZDK  [CONN-TH_3P-P2.50_2.54-3P-ZZDK]  96.39 48.16 270 top
J9  2.54-3PZZDK  [CONN-TH_3P-P2.50_2.54-3P-ZZDK]  96.39 35.46 270 top
P1  2.54-4P  [CONN-TH_B4B-XH-A-BK-LF-SN]  48.26 96.04 180 top
P2  2.54-4P  [CONN-TH_B4B-XH-A-BK-LF-SN]  63.5 96.04 180 top
R1  1k  [R0603]  17.54 15.65 180 top
R2  5.1K  [R0603]  81.53 87.53 90 top
R3  20Ω  [R0603]  60.07 69.88 180 top
R4  20Ω  [R0603]  60.07 72.54 180 top
R5  20Ω  [R0603]  60.07 74.79 180 top
R6  20Ω  [R0603]  60.07 77.24 180 top
R7  20Ω  [R0603]  76.96 76.86 180 top
R8  20Ω  [R0603]  77.09 74.79 180 top
R9  20Ω  [R0603]  77.09 72.33 180 top
R10  20Ω  [R0603]  77.09 69.88 180 top
R12  20Ω  [R0603]  60.71 47.65 180 top
R13  20Ω  [R0603]  59.56 50.19 180 top
R14  100kΩ  [R0603]  10.67 84.48 0 top
R15  100kΩ  [R0603]  10.67 86.89 0 top
R17  100kΩ  [R0603]  78.62 59.95 0 top
R18  100kΩ  [R0603]  10.67 89.29 0 top
R19  100kΩ  [R0603]  78.74 57.81 0 top
R20  1k  [R0603]  17.27 12.47 180 top
R23  20R  [R0603]  89.15 23.78 0 top
R24  20R  [R0603]  89.14 21.64 0 top
R25  20R  [R0603]  74.68 22.13 180 top
R26  20R  [R0603]  74.8 24.28 180 top
R27  20R  [R0603]  74.74 26.34 180 top
R28  20R  [R0603]  60.69 46 180 top
R30  20R  [R0603]  89.2 25.78 0 top
R32  100K  [R0603]  82.8 10.06 270 top
R33  100K  [R0603]  81.03 10.06 270 top
R34  100K  [R0603]  76.45 10.06 270 top
R35  100K  [R0603]  78.74 10.06 270 top
SCREW1  -  [M3螺丝]  5 6.03 0 top
SCREW2  -  [M3螺丝]  95 6.03 0 top
SCREW3  -  [M3螺丝]  95 94.03 0 top
SCREW4  -  [M3螺丝]  5 94.03 0 top
U1  SN74LVC244APWR  [TSSOP-20_L6.5-W4.4-P0.65-LS6.4-BL]  68.07 72.93 90 top
U2  SN74LVC244APWR  [TSSOP-20_L6.5-W4.4-P0.65-LS6.4-BL]  67.69 48.41 90 top
U3  SN74LVC244APWR  [TSSOP-20_L6.5-W4.4-P0.65-LS6.4-BL]  82.42 24.79 270 top

## Footprints (pads in the part's own frame, mm; a bottom-side part is the same pattern mirrored in y, then rotated)
C0603
  rect 0.8x0.9 smd: 1(-0.7,0) 2(0.7,0)
C0805
  rect 1.41x1.35 smd: 1(-1,0) 2(1,0)
CONN-SMD_8P-P1.25_JXT-GH1.25-8PWT
  rect 0.6x1.7 smd: 1(-4.375,1.6) 2(-3.125,1.6) 3(-1.875,1.6) 4(-0.625,1.6) 5(0.625,1.6) 6(1.875,1.6) 7(3.125,1.6) 8(4.375,1.6)
  rect 1x2.7 smd: 9(-6.205,-1.6) 10(6.205,-1.6)
CONN-SMD_9P-P1.25_BX-GH1.25-9PWT
  rect 0.6x1.7 smd: 1(-5,1.575) 2(-3.75,1.575) 3(-2.5,1.575) 4(-1.25,1.575) 5(0,1.575) 6(1.25,1.575) 7(2.5,1.575) 8(3.75,1.575) 9(5,1.575)
  rect 1x2.8 smd: 10(6.85,-1.575) 11(-6.85,-1.575)
CONN-TH_2P-P2.54_C9900022459
  rect 2.1x2.1 hole 1.3: 1(-1.27,0)
  round 2.1 hole 1.3: 2(1.27,0)
CONN-TH_3P-P2.50_2.54-3P-ZZDK
  rect 1.7x1.7 hole 0.9: 1(-2.5,0)
  round 1.7 hole 0.9: 2(0,0) 3(2.5,0)
CONN-TH_B4B-XH-A-BK-LF-SN
  rect 1.6x1.6 hole 1: 1(-3.75,0)
  round 1.6 hole 1: 2(-1.25,0) 3(1.25,0) 4(3.75,0)
HDR-TH_6P-P2.00-V-F
  rect 1.4x1.4 hole 0.8: 1(-5,0)
  round 1.4 hole 0.8: 2(-2.46,0) 3(0.08,0) 4(2.62,0) 5(5.16,0) 6(7.7,0)
IDC40P
  round 1.2 hole 1.02: 1(42.037,0) 2(42.037,2.544) 3(44.577,0) 4(44.577,2.544) 5(47.117,0) 6(47.117,2.544) 7(49.657,0) 8(49.657,2.544) 9(52.197,0) 10(52.197,2.544) 11(54.737,0) 12(54.737,2.544) 13(57.277,0) 14(57.277,2.544) 15(59.817,0) 16(59.817,2.544) 17(62.357,0) 18(62.357,2.544) 19(64.897,0) 20(64.897,2.544) 21(67.437,0) 22(67.437,2.544) 23(69.977,0) 24(69.977,2.544) 25(72.517,0) 26(72.517,2.544) 27(75.057,0) 28(75.057,2.544) 29(77.597,0) 30(77.597,2.544) 31(80.137,0) 32(80.137,2.544) 33(82.677,0) 34(82.677,2.544) 35(85.217,0) 36(85.217,2.544) 37(87.757,0) 38(87.757,2.544) 39(90.297,0) 40(90.297,2.544)
IDC-TH_26P-P2.54-V-M-R2-C13-S2.54
  rect 1.8x1.8 hole 1.005x1: 1(15.24,1.27)
  round 1.8 hole 1.005x1: 2(15.24,-1.27) 3(12.7,1.27) 4(12.7,-1.27) 5(10.16,1.27) 6(10.16,-1.27) 7(7.62,1.27) 8(7.62,-1.27) 9(5.08,1.27) 10(5.08,-1.27) 11(2.54,1.27) 12(2.54,-1.27) 13(0,1.27) 14(0,-1.27) 15(-2.54,1.27) 16(-2.54,-1.27) 17(-5.08,1.27) 18(-5.08,-1.27) 19(-7.62,1.27) 20(-7.62,-1.27) 21(-10.16,1.27) 22(-10.16,-1.27) 23(-12.7,1.27) 24(-12.7,-1.27) 25(-15.24,1.27) 26(-15.24,-1.27)
LED0603-R-RD_RED
  rect 0.8x0.8 smd: 1(0.851,0) 2(-0.851,0)
M3螺丝
  round 3.2 hole 3.2: 1(0,0)
R0603
  rect 0.806x0.864 smd: 1(-0.753,0) 2(0.753,0)
TSSOP-20_L6.5-W4.4-P0.65-LS6.4-BL
  oval 0.364x1.742 smd: 1(-2.925,-2.871) 2(-2.275,-2.871) 3(-1.625,-2.871) 4(-0.975,-2.871) 5(-0.325,-2.871) 6(0.325,-2.871) 7(0.975,-2.871) 8(1.625,-2.871) 9(2.275,-2.871) 10(2.925,-2.871) 11(2.925,2.871) 12(2.275,2.871) 13(1.625,2.871) 14(0.975,2.871) 15(0.325,2.871) 16(-0.325,2.871) 17(-0.975,2.871) 18(-1.625,2.871) 19(-2.275,2.871) 20(-2.925,2.871)

## Nets
As in the schematic.

Pads without a net: SCREW1 1; SCREW2 1; SCREW3 1; SCREW4 1; U2 3 5 7 9 12; U3 3 18

## Via types
v1: diameter 0.61, hole 0.305, Top Layer to Bottom Layer, 894 vias

## Routing (per net, layer and track width the routed paths; a pad name or vN(x,y) marks a point on that pad's centre or on a via; arc(x,y) is an arc through that point)
3V3: length 384
  Top Layer w0.508: 78.61,10.81 78.61,12.73 79.5,13.62 84.33,13.62 87.12,10.82 v1(91.31,10.82) ; v1(83.31,78.26) 83.46,78.4 95.48,78.4 95.62,78.26 ; v1(83.31,78.26) 57.05,78.26 52.3,83.01 52.3,95.41 ; v1(83.31,78.26) v1(83.31,73.81) ; v1(13.72,15.65) 16.64,15.65 ; 8.81,36.29 C3.2 14.02,36.29 v1(14.48,35.83) ; 8.81,36.29 8.74,36.22 7.37,36.22 6.86,35.71 4.06,35.71 2.92,34.57 ; 8.81,36.29 C4.2 ; v1(25.71,93.93) 26.22,94.44 46.34,94.44 47.3,95.41 ; v1(78.11,50.57) 74.89,50.57 v1(72.2,53.26) 73.15,54.22 73.15,59.27 73.82,59.95 R17.1 79.21,61.29 J3.1 83.44,61.42 v1(83.44,66.7) 75.44,66.7 74.04,68.1 65.34,68.1 C1.2 65.2,68.24 65.2,70 ; 96.39,77.97 98.3,76.06 98.3,66.66 J7.1 98.3,62.85 98.3,52.57 J8.1 98.55,48.5 98.55,40.12 J9.1
  Top Layer w0.762: P1.3 47.01,97.2 48.01,98.2 51.18,98.2 52.01,97.37 P1.1
  Bottom Layer w0.508: v1(14.35,81.43) 14.48,81.31 v1(14.48,35.83) 14.48,34.7 15.75,33.43 15.75,19.71 13.72,17.68 v1(13.72,15.65) ; v1(14.35,81.43) 22.48,81.43 26.56,85.51 v1(26.56,89.18) ; v1(14.35,81.43) 10.54,81.43 9.78,82.2 v1(9.78,85.63) ; v1(83.31,78.26) 83.31,93.37 CN1.2 ; v1(91.31,10.82) 93.47,12.98 93.47,27.08 91.82,28.73 89.4,28.73 ; v1(83.44,66.7) 83.44,73.69 v1(83.31,73.81) ; 89.4,28.73 89.4,31.76 96.14,38.5 ; 89.4,28.73 v1(87.28,28.73) ; v1(72.2,53.26) 67.69,48.76 67.69,46.64 65.79,44.73 v1(64.9,44.73)
  vias: v1(26.97,91.21) v1(63.75,44.73) v1(69.72,11.08) v1(69.85,8.41) v1(69.85,7.52) v1(69.85,6.76) v1(70.87,11.08) v1(70.93,8.41) v1(72.47,14.09) v1(73.78,14.09) v1(79.12,50.57) v1(86.23,28.73) v1(86.87,27.97)
5V: length 159.1
  Top Layer w0.508: R20.2 6.22,12.47 1.14,17.55 1.14,55.66 2.92,57.43 1.27,59.08 1.27,74.96 4.19,77.88 v1(16.26,77.88)
  Top Layer w0.762: P2.1 67.6,96.38 67.6,97.66 67.06,98.2 64.41,98.2 P2.3
  Bottom Layer w0.508: 62.29,95.41 62.29,86.7 53.47,77.88 v1(16.26,77.88)
GND: length 12.5
  Top Layer w0.254: U2.11 64.82,51.34 v1(62.61,51.34) ; v1(67.56,42.7) 66.68,43.59 C2.1 ; R19.1 v1(74.3,57.81) ; 68.71,77.12 68.71,76.48 69.34,75.85 U1.10 ; C1.1 65.28,65.18 v1(65.41,65.05)
  vias: v1(3.15,89.82) v1(3.15,88.42) v1(3.15,87.15) v1(3.15,86.13) v1(3.15,84.99) v1(3.16,83.85) v1(3.16,82.45) v1(3.16,81.18) v1(3.16,80.16) v1(3.16,79.02) v1(4.16,89.82) v1(4.16,88.42) v1(4.16,87.15) v1(4.16,86.13) v1(4.16,84.99) v1(4.17,83.85) v1(4.17,82.45) v1(4.17,81.18) v1(4.17,80.16) v1(4.17,79.02) v1(5.18,89.82) v1(5.18,88.42) v1(5.18,87.15) v1(5.18,86.13) v1(5.18,84.99) v1(5.18,83.85) v1(5.18,82.45) v1(5.18,81.18) v1(5.18,80.16) v1(5.18,79.02) v1(6.1,76.48) v1(6.19,89.82) v1(6.19,88.42) v1(6.19,87.15) v1(6.19,86.13) v1(6.19,84.99) v1(6.19,83.85) v1(6.19,82.45) v1(6.19,81.18) v1(6.19,80.16) v1(6.19,79.02) v1(7.11,76.48) v1(7.24,83.85) v1(7.2,82.45) v1(7.2,81.18) v1(7.2,80.16) v1(7.2,79.02) v1(8.12,76.48) v1(9.13,76.48) v1(9.91,9.43) v1(9.91,8.03) v1(9.91,6.76) v1(9.91,5.74) v1(9.91,4.6) v1(9.91,3.58) v1(9.91,2.44) v1(10.92,9.43) v1(10.92,8.03) v1(10.92,6.76) v1(10.92,5.74) v1(10.92,4.6) v1(10.92,3.58) v1(10.92,2.44) v1(11.93,9.43) v1(11.93,8.03) v1(11.93,6.76) v1(11.93,5.74) v1(11.93,4.6) v1(11.93,3.58) v1(11.93,2.44) v1(12.94,9.43) v1(12.94,8.03) v1(12.94,6.76) v1(12.94,5.74) v1(12.94,4.6) v1(12.94,3.58) v1(12.94,2.44) v1(13.95,9.43) v1(13.95,8.03) v1(13.95,6.76) v1(13.95,5.74) v1(13.95,4.6) v1(13.95,3.58) v1(13.95,2.44) v1(14.96,9.43) v1(14.96,8.03) v1(14.96,6.76) v1(14.96,5.74) v1(14.96,4.6) v1(14.96,3.58) v1(14.96,2.44) v1(15.97,9.43) v1(15.97,8.03) v1(15.97,6.76) v1(15.97,5.74) v1(15.97,4.6) v1(15.97,3.58) v1(15.97,2.44) v1(16.26,74.32) v1(16.5,75.85) v1(16.5,72.8) v1(16.98,9.43) v1(16.98,8.03) v1(16.98,6.76) v1(16.98,5.74) v1(16.98,4.6) v1(16.98,3.58) v1(16.98,2.44) v1(17.13,58.7) v1(17.13,57.3) v1(17.52,75.85) v1(17.52,72.8) v1(17.53,36.22) v1(17.53,35.21) v1(17.53,34.06) v1(17.53,32.79) v1(17.53,31.78) v1(17.53,30.63) v1(17.64,74.32) v1(17.99,9.43) v1(17.99,8.03) v1(17.99,6.76) v1(17.99,5.74) v1(17.99,4.6) v1(17.99,3.58) v1(17.99,2.44) v1(18.14,58.7) v1(18.14,57.3) v1(18.53,75.85) v1(18.53,72.8) v1(18.54,36.22) v1(18.54,35.21) v1(18.54,34.06) v1(18.54,32.79) v1(18.54,31.78) v1(18.54,30.63) v1(18.65,74.32) v1(19,9.43) v1(19,8.03) v1(19,6.76) v1(19,5.74) v1(19,4.6) v1(19,3.58) v1(19,2.44) v1(19.55,36.22) v1(19.55,35.21) v1(19.55,34.06) v1(19.55,32.79) v1(19.55,31.78) v1(19.55,30.63) v1(20.01,9.43) v1(20.01,8.03) v1(20.01,6.76) v1(20.01,5.74) v1(20.01,4.6) v1(20.01,3.58) v1(20.01,2.44) v1(21.02,9.43) v1(21.02,8.03) v1(21.02,6.76) v1(21.02,5.74) v1(21.02,4.6) v1(21.02,3.58) v1(21.02,2.44) v1(21.22,32.79) v1(21.22,31.78) v1(21.22,30.63) v1(22.03,9.43) v1(22.03,8.03) v1(22.03,6.76) v1(22.03,5.74) v1(22.03,4.6) v1(22.03,3.58) v1(22.03,2.44) v1(22.23,32.79) v1(22.23,31.78) v1(22.23,30.63) v1(23.24,32.79) v1(23.24,31.78) v1(23.24,30.63) v1(23.37,9.43) v1(23.37,7.9) v1(24.38,9.43) v1(24.38,7.9) v1(24.52,32.79) v1(24.52,31.78) v1(24.52,30.63) v1(25.39,9.43) v1(25.39,7.9) v1(25.53,32.79) v1(25.53,31.78) v1(25.53,30.63) v1(26.4,9.43) v1(26.4,7.9) v1(26.54,32.79) v1(26.54,31.78) v1(26.54,30.63) v1(27.95,32.79) v1(27.95,31.78) v1(27.95,30.63) v1(28.96,32.79) v1(28.96,31.78) v1(28.96,30.63) v1(29.97,32.79) v1(29.97,31.78) v1(29.97,30.63) v1(30.1,67.34) v1(30.2,64.54) v1(31.37,90.58) v1(31.37,89.18) v1(31.37,87.91) v1(31.37,86.9) v1(31.37,85.75) v1(31.37,84.23) v1(31.37,82.83) v1(31.37,81.56) v1(31.37,80.55) v1(31.37,79.4) v1(32.38,90.58) v1(32.38,89.18) v1(32.38,87.91) v1(32.38,86.9) v1(32.38,85.75) v1(32.38,84.23) v1(32.38,82.83) v1(32.38,81.56) v1(32.38,80.55) v1(32.38,79.4) v1(32.51,67.34) v1(32.48,62.51) v1(32.61,64.54) v1(33.39,90.58) v1(33.39,89.18) v1(33.39,87.91) v1(33.39,86.9) v1(33.39,85.75) v1(33.39,84.23) v1(33.39,82.83) v1(33.39,81.56) v1(33.39,80.55) v1(33.39,79.4) v1(34.04,60.73) v1(34.4,90.58) v1(34.4,89.18) v1(34.4,87.91) v1(34.4,86.9) v1(34.4,85.75) v1(34.4,84.23) v1(34.4,82.83) v1(34.4,81.56) v1(34.4,80.55) v1(34.4,79.4) v1(34.9,62.51) v1(35.18,67.34) v1(35.28,64.54) v1(35.56,58.96) v1(36.2,90.58) v1(36.2,89.18) v1(36.2,87.91) v1(36.2,86.9) v1(36.2,85.75) v1(36.2,84.23) v1(36.2,82.83) v1(36.2,81.56) v1(36.2,80.55) v1(36.2,79.4) v1(36.45,60.73) v1(37.08,57.18) v1(37.21,90.58) v1(37.21,89.18) v1(37.21,87.91) v1(37.21,86.9) v1(37.21,85.75) v1(37.21,84.23) v1(37.21,82.83) v1(37.21,81.56) v1(37.21,80.55) v1(37.21,79.4) v1(37.56,62.51) v1(37.97,58.96) v1(38.22,90.58) v1(38.22,89.18) v1(38.22,87.91) v1(38.22,86.9) v1(38.22,85.75) v1(38.22,84.23) v1(38.22,82.83) v1(38.22,81.56) v1(38.22,80.55) v1(38.22,79.4) v1(38.23,67.34) v1(38.33,64.54) v1(39.12,60.73) v1(39.23,90.58) v1(39.23,89.18) v1(39.23,87.91) v1(39.23,86.9) v1(39.23,85.75) v1(39.23,84.23) v1(39.23,82.83) v1(39.23,81.56) v1(39.23,80.55) v1(39.23,79.4) v1(39.75,57.18) v1(40.61,62.51) v1(40.64,58.96) v1(40.89,67.34) v1(40.99,64.54) v1(41.28,84.23) v1(41.28,82.83) v1(41.28,81.56) v1(41.28,80.55) v1(41.28,79.4) v1(41.4,90.58) v1(41.4,89.18) v1(41.4,87.91) v1(41.4,86.9) v1(41.4,85.75) v1(42.16,60.73) v1(42.29,84.23) v1(42.29,82.83) v1(42.29,81.56) v1(42.29,80.55) v1(42.29,79.4) v1(42.41,90.58) v1(42.41,89.18) v1(42.41,87.91) v1(42.41,86.9) v1(42.41,85.75) v1(42.8,57.18) v1(43.3,84.23) v1(43.3,82.83) v1(43.3,81.56) v1(43.3,80.55) v1(43.3,79.4) v1(43.28,62.51) v1(43.42,90.58) v1(43.42,89.18) v1(43.42,87.91) v1(43.42,86.9) v1(43.42,85.75) v1(43.56,67.34) v1(43.69,64.67) v1(43.69,58.96) v1(44.31,84.23) v1(44.31,82.83) v1(44.31,81.56) v1(44.31,80.55) v1(44.31,79.4) v1(44.43,90.58) v1(44.43,89.18) v1(44.43,87.91) v1(44.43,86.9) v1(44.43,85.75) v1(44.83,60.73) v1(45.47,57.18) v1(45.72,67.46) v1(45.85,84.23) v1(45.85,82.83) v1(45.85,81.56) v1(45.85,80.55) v1(45.85,79.4) v1(45.95,62.51) v1(45.97,90.58) v1(45.97,89.18) v1(45.97,87.91) v1(45.97,86.9) v1(45.97,85.75) v1(46.36,58.96) v1(46.48,64.8) v1(46.86,84.23) v1(46.86,82.83) v1(46.86,81.56) v1(46.86,80.55) v1(46.86,79.4) v1(46.99,90.58) v1(46.99,89.18) v1(46.99,87.91) v1(46.99,86.9) v1(46.99,85.75) v1(47.87,84.23) v1(47.87,82.83) v1(47.87,81.56) v1(47.87,80.55) v1(47.87,79.4) v1(48,90.58) v1(48,89.18) v1(48,87.91) v1(48,86.9) v1(48,85.75) v1(48.77,64.67) v1(48.77,62.51) v1(48.88,84.23) v1(48.88,82.83) v1(48.88,81.56) v1(48.88,80.55) v1(48.88,79.4) v1(49.01,90.58) v1(49.01,89.18) v1(49.01,87.91) v1(49.01,86.9) v1(49.01,85.75) v1(49.53,60.48) v1(49.53,59.08) v1(49.53,57.69) v1(49.91,67.59) v1(50.54,60.48) v1(50.54,59.08) v1(50.54,57.69) v1(51.55,60.48) v1(51.55,59.08) v1(51.55,57.69) v1(51.88,67.59) v1(52.56,60.48) v1(52.56,59.08) v1(52.56,57.69) v1(52.78,64.92) v1(54.03,67.59) v1(54.1,56.16) v1(54.91,64.92) v1(54.99,90.07) v1(54.99,88.67) v1(54.99,87.4) v1(54.99,86.39) v1(54.99,85.24) v1(55.11,56.16) v1(56,90.07) v1(56,88.67) v1(56,87.4) v1(56,86.39) v1(56,85.24) v1(56.12,56.16) v1(57.01,90.07) v1(57.01,88.67) v1(57.01,87.4) v1(57.01,86.39) v1(57.01,85.24) v1(57.13,56.16) v1(58.02,90.07) v1(58.02,88.67) v1(58.02,87.4) v1(58.02,86.39) v1(58.02,85.24) v1(59.57,67.59) v1(59.57,64.92) v1(60.96,38.76) v1(60.96,36.1) v1(62.09,67.59) v1(62.23,14.76) v1(62.23,13.02) v1(62.23,10.82) v1(62.23,8.83) v1(62.48,64.92) v1(63.5,38.64) v1(64.39,90.58) v1(64.39,89.18) v1(64.39,87.91) v1(64.39,86.9) v1(64.39,85.75) v1(64.39,84.61) v1(64.39,83.21) v1(64.39,81.94) v1(64.39,80.93) v1(64.39,79.78) v1(64.9,62) v1(64.9,60.35) v1(64.9,58.83) v1(64.9,57.43) v1(65.4,90.58) v1(65.4,89.18) v1(65.4,87.91) v1(65.4,86.9) v1(65.4,85.75) v1(65.4,84.61) v1(65.4,83.21) v1(65.4,81.94) v1(65.4,80.93) v1(65.4,79.78) v1(65.91,62) v1(65.91,60.35) v1(65.91,58.83) v1(65.91,57.43) v1(66.41,90.58) v1(66.41,89.18) v1(66.41,87.91) v1(66.41,86.9) v1(66.41,85.75) v1(66.41,84.61) v1(66.41,83.21) v1(66.41,81.94) v1(66.41,80.93) v1(66.41,79.78) v1(66.92,62) v1(66.92,60.35) v1(66.92,58.83) v1(67.42,90.58) v1(67.42,89.18) v1(67.42,87.91) v1(67.42,86.9) v1(67.42,85.75) v1(67.42,84.61) v1(67.42,83.21) v1(67.42,81.94) v1(67.42,80.93) v1(67.42,79.78) v1(67.93,62) v1(67.93,60.35) v1(67.93,58.83) v1(68.71,77.17) v1(69.09,90.58) v1(69.09,89.18) v1(69.09,87.91) v1(69.09,86.9) v1(69.09,85.75) v1(69.09,84.48) v1(69.09,83.09) v1(69.09,81.82) v1(69.09,80.8) v1(69.09,79.66) v1(69.09,54.89) v1(69.09,53.37) v1(70.1,90.58) v1(70.1,89.18) v1(70.1,87.91) v1(70.1,86.9) v1(70.1,85.75) v1(70.1,84.48) v1(70.1,83.09) v1(70.1,81.82) v1(70.1,80.8) v1(70.1,79.66) v1(70.74,64.54) v1(70.74,62.89) v1(70.74,61.37) v1(70.74,59.84) v1(70.74,58.19) v1(70.74,56.67) v1(70.74,54.89) v1(70.74,53.37) v1(71.11,90.58) v1(71.11,89.18) v1(71.11,87.91) v1(71.11,86.9) v1(71.11,85.75) v1(71.11,84.48) v1(71.11,83.09) v1(71.11,81.82) v1(71.11,80.8) v1(71.11,79.66) v1(71.11,43.46) v1(72.12,90.58) v1(72.12,89.18) v1(72.12,87.91) v1(72.12,86.9) v1(72.12,85.75) v1(72.12,84.48) v1(72.12,83.09) v1(72.12,81.82) v1(72.12,80.8) v1(72.12,79.66) v1(73.66,90.71) v1(73.66,89.31) v1(73.66,88.04) v1(73.66,87.02) v1(73.66,85.88) v1(73.79,84.48) v1(73.79,83.09) v1(73.79,81.82) v1(73.79,80.8) v1(73.79,79.66) v1(74.67,90.71) v1(74.67,89.31) v1(74.67,88.04) v1(74.67,87.02) v1(74.67,85.88) v1(74.8,84.48) v1(74.8,83.09) v1(74.8,81.82) v1(74.8,80.8) v1(74.8,79.66) v1(75.68,90.71) v1(75.68,89.31) v1(75.68,88.04) v1(75.68,87.02) v1(75.68,85.88) v1(75.81,84.48) v1(75.81,83.09) v1(75.81,81.82) v1(75.81,80.8) v1(75.81,79.66) v1(76.69,90.71) v1(76.69,89.31) v1(76.69,88.04) v1(76.69,87.02) v1(76.69,85.88) v1(76.82,84.48) v1(76.82,83.09) v1(76.82,81.82) v1(76.82,80.8) v1(76.82,79.66) v1(77.47,47.02) v1(77.48,45.97) v1(77.6,49.15) v1(77.6,48.13) v1(78.49,46.99) v1(78.49,45.97) v1(78.61,49.15) v1(78.61,48.13) v1(79.51,49.15) v1(79.51,48.13) v1(79.51,46.99) v1(79.51,45.97) v1(80.52,49.15) v1(80.52,48.13) v1(80.52,46.99) v1(80.91,41.15) v1(80.91,40.13) v1(81.92,41.15) v1(81.92,40.13) v1(83.7,43.69) v1(83.7,42.67) v1(84.71,43.69) v1(84.71,42.67) v1(84.96,86.39) v1(84.96,85.24) v1(84.96,83.97) v1(84.96,82.58) v1(84.96,81.31) v1(84.96,80.29) v1(84.96,79.15) v1(85.1,76.83) v1(85.1,75.82) v1(85.1,74.68) v1(85.1,73.66) v1(85.97,86.39) v1(85.97,85.24) v1(85.97,83.97) v1(85.97,82.58) v1(85.97,81.31) v1(85.97,80.29) v1(85.97,79.15) v1(86.11,76.83) v1(86.11,75.82) v1(86.11,74.68) v1(86.11,73.66) v1(86.62,72.01) v1(86.62,70.99) v1(86.98,86.39) v1(86.98,85.24) v1(86.98,83.97) v1(86.98,82.58) v1(86.98,81.31) v1(86.98,80.29) v1(86.98,79.15) v1(87.5,61.88) v1(87.5,60.86) v1(87.5,59.72) v1(87.5,58.57) v1(87.5,57.43) v1(87.63,72.01) v1(87.63,70.99) v1(87.64,42.32) v1(87.64,41.3) v1(87.64,40.16) v1(87.64,39.14) v1(87.64,38) v1(87.64,36.98) v1(87.64,35.84) v1(87.64,34.83) v1(87.76,48.13) v1(87.76,47.12) v1(87.76,45.97) v1(87.76,44.96) v1(87.99,86.39) v1(87.99,85.24) v1(87.99,83.97) v1(87.99,82.58) v1(87.99,81.31) v1(87.99,80.29) v1(87.99,79.15) v1(88.52,61.88) v1(88.52,60.86) v1(88.52,59.72) v1(88.52,58.57) v1(88.52,57.43) v1(88.65,42.32) v1(88.65,41.3) v1(88.65,40.16) v1(88.65,39.14) v1(88.65,38) v1(88.65,36.98) v1(88.65,35.84) v1(88.65,34.83) v1(88.78,72.01) v1(88.78,70.99) v1(88.77,48.13) v1(88.77,47.12) v1(88.77,45.97) v1(88.77,44.96) v1(89.41,86.39) v1(89.41,85.12) v1(89.41,83.97) v1(89.41,82.45) v1(89.41,81.31) v1(89.41,80.29) v1(89.67,48.13) v1(89.67,47.12) v1(89.66,46) v1(89.67,44.96) v1(89.79,72.01) v1(89.79,70.99) v1(89.92,42.32) v1(89.92,41.3) v1(89.92,40.16) v1(89.92,39.14) v1(89.92,38) v1(89.92,36.98) v1(89.92,35.84) v1(89.92,34.83) v1(90.42,86.39) v1(90.42,85.12) v1(90.42,83.97) v1(90.42,82.45) v1(90.42,81.31) v1(90.42,80.29) v1(91.43,86.39) v1(91.43,85.12) v1(91.43,83.97) v1(91.43,82.45) v1(91.43,81.31) v1(91.43,80.29) v1(92.44,86.39) v1(92.44,85.12) v1(92.44,83.97) v1(92.44,82.45) v1(92.44,81.31) v1(92.44,80.29) v1(93.59,89.56) v1(93.59,88.17) v1(93.59,86.9) v1(93.59,85.88) v1(93.59,84.74) v1(93.73,83.47) v1(94.6,89.56) v1(94.6,88.17) v1(94.6,86.9) v1(94.6,85.88) v1(94.6,84.74) v1(94.74,83.47) v1(95.61,89.56) v1(95.61,88.17) v1(95.61,86.9) v1(95.61,85.88) v1(95.61,84.74) v1(95.63,20.98) v1(95.63,19.59) v1(95.63,18.24) v1(95.63,16.85) v1(95.63,15.27) v1(95.63,13.87) v1(95.75,83.47) v1(96.62,89.56) v1(96.62,88.17) v1(96.62,86.9) v1(96.62,85.88) v1(96.62,84.74) v1(96.76,83.47) v1(96.93,20.98) v1(96.93,19.59) v1(96.93,18.24) v1(96.93,16.85) v1(96.93,15.27) v1(96.93,13.87) v1(98.23,20.98) v1(98.23,19.59) v1(98.23,18.24) v1(98.23,16.85) v1(98.23,15.27) v1(98.23,13.87)
(no net):
  vias: v1(11.4,85.63)
BUF_NOE: length 74
  Top Layer w0.254: 67.06,70 66.41,70.65 65.2,70.65 ; 85.29,27.07 83.32,27.07 82.67,27.72 ; v1(76.33,68.1) 74.43,70 70.94,70 70.74,70 70.74,70 ; 76.07,41.56 v1(75.31,42.32) 72.14,45.49 68.2,45.49
  Bottom Layer w0.254: 80.92,93.12 80.92,89.71 v1(80.52,89.31) 80.14,88.93 80.14,75.21 76.33,71.4 v1(76.33,68.1) 76.33,43.33 v1(75.31,42.32)
BUF_nOE: length 28.2
  Top Layer w0.254: 80.56,89.25 80.69,89.25 81.53,88.41 R2.2 ; 82.67,27.72 U3.1 77.85,27.72 76.07,29.49 76.07,41.56 ; 68.2,45.49 67.55,46.14 U2.19 ; 67.06,70 70.74,70
EPD2_BUSY: length 54.3
  Top Layer w0.254: v1(72.62,46.13) 70.57,46.13 U2.2 ; 80.64,9.32 79.88,8.55 v1(79.88,8.3) 79.88,8.15 79.82,8.1 CN3.8 ; v1(74.68,36.35) 74.68,41.3 v1(72.62,43.35)
  Bottom Layer w0.254: v1(72.62,43.35) v1(72.62,46.13) ; v1(79.88,8.3) 79.88,15.26 85.34,20.73 85.34,32.16 81.15,36.35 v1(74.68,36.35)
EPD2_BUSY_BUF: length 3.7
  Top Layer w0.254: U2.18 63.4,46.79 62.61,46 R28.1
EPD2_CLK: length 39.8
  Top Layer w0.254: CN3.4 74.82,4.71 v1(73.57,3.46) ; R23.2 90.92,22.76 v1(91.44,22.76)
  Bottom Layer w0.254: v1(91.44,22.76) 91.44,11.78 90.73,11.06 90.73,10.58 91.44,9.87 91.44,9.43 85.47,3.46 v1(73.57,3.46)
EPD2_CLK_BUF: length 3.1
  Top Layer w0.254: U3.14 85.34,23.78 R23.1
EPD2_CS: length 30.4
  Top Layer w0.254: CN3.5 76.07,7.27 75.4,7.94 75.4,9.22 v1(75.31,9.31) R34.2 ; v1(76.2,20.22) 89.54,20.22 89.92,20.6 89.92,21.61 R24.2
  Bottom Layer w0.254: v1(75.31,9.31) 75.31,19.33 v1(76.2,20.22)
EPD2_CS_BUF: length 3.5
  Top Layer w0.254: 88.38,21.64 87.49,21.64 86.6,22.52 U3.12
EPD2_DC: length 34.2
  Top Layer w0.254: CN3.6 v1(77.32,2.57)
  Bottom Layer w0.254: v1(73.91,22.13) 73.91,17.81 68.07,11.97 68.07,4.22 69.72,2.57 v1(77.32,2.57)
EPD2_DC_BUF: length 4.3
  Top Layer w0.254: R25.1 76.45,22.13 76.85,22.52 U3.9
EPD2_DIN: length 40.6
  Top Layer w0.254: v1(91.82,26.82) 91,26.82 R30.2 ; CN3.3 v1(73.57,4.6)
  Bottom Layer w0.254: v1(73.57,4.6) 84.71,4.6 87,6.89 87,22 v1(91.82,26.82)
EPD2_DIN_BUF: length 3.4
  Top Layer w0.254: U3.16 87.78,25.12 R30.1
EPD2_PWR: length 32.3
  Top Layer w0.254: 73.99,26.34 72.77,25.12 72.77,20.35 74.04,19.08 81.53,19.08 v1(83.95,16.66) ; CN3.9 81.07,7.82 81.41,8.16 82.04,8.16 82.8,8.92 82.8,9.31 84.44,9.31 v1(84.46,9.3)
  Bottom Layer w0.254: v1(83.95,16.66) 84.46,16.16 v1(84.46,9.3)
EPD2_PWR_BUF: length 4.6
  Top Layer w0.254: R27.1 76.94,26.34 78.16,25.12 U3.5
EPD2_RST: length 23.8
  Top Layer w0.254: 78.61,9.31 78.36,9.05 v1(77.6,9.05) 77.6,8.66 78.57,7.69 CN3.7
  Bottom Layer w0.254: v1(74.04,24.28) 74.5,23.83 74.5,8.46 75.06,7.9 76.45,7.9 v1(77.6,9.05)
EPD2_RST_BUF: length 4.2
  Top Layer w0.254: R26.1 77.09,24.28 77.56,23.82 U3.7
EPD_BUSY: length 97.3
  Top Layer w0.254: CN2.8 16.96,91.73 v1(16.95,91.72) 16.89,91.66 16.89,78.69 25.1,70.49 44.99,70.49 60.07,55.4 60.07,52.86 60.83,52.1 71.88,52.1 73.28,50.7 73.28,48.41 72.26,47.4 70.6,47.4 U2.4 ; 11.67,89.29 v1(13.24,89.29)
  Bottom Layer w0.254: v1(16.95,91.72) 16.95,90.38 15.86,89.29 v1(13.24,89.29)
EPD_CLK: length 55
  Top Layer w0.254: v1(51.81,75.49) 27.17,75.49 21.95,80.7 21.95,92.97 21.96,92.98 CN2.4 ; R4.2 59.19,72.42 v1(57.79,72.42)
  Bottom Layer w0.254: v1(57.79,72.42) 57.77,72.4 54.88,72.4 54.86,72.42 53.34,72.42 51.82,73.94 51.82,75.48 v1(51.81,75.49)
EPD_CS: length 70.9
  Top Layer w0.254: 20.7,94.43 v1(20.7,91.72) 20.7,80.19 26.65,74.24 54.78,74.24 v1(54.99,74.45) ; R5.2 58.98,74.45 v1(56.64,74.45) ; 11.67,84.48 11.8,84.61 v1(14.1,84.61)
  Bottom Layer w0.254: v1(20.7,91.72) 20.7,86.13 19.18,84.61 v1(14.1,84.61) ; v1(56.64,74.45) v1(54.99,74.45)
EPD_DC: length 60.7
  Top Layer w0.254: v1(55.12,72.99) 26.13,72.99 19.45,79.67 19.45,93.92 CN2.6 ; v1(57.53,77.24) R6.2
  Bottom Layer w0.254: v1(57.53,77.24) 57.53,73.81 56.7,72.99 v1(55.12,72.99)
EPD_DIN: length 56.6
  Top Layer w0.254: v1(55.75,70.79) 55.75,76.1 55.12,76.74 27.69,76.74 23.2,81.22 23.2,92.69 23.21,92.7 CN2.3 ; R3.2 v1(58.06,69.88)
  Bottom Layer w0.254: v1(55.75,70.79) 56.67,69.88 v1(58.06,69.88)
EPD_RST: length 101.8
  Top Layer w0.254: 18.16,94.58 18.2,94.54 18.2,93.94 ; v1(54.99,71.66) 54.91,71.74 25.62,71.74 18.2,79.15 18.2,93.94 ; R7.1 77.84,76.74 v1(79.38,76.74) ; 18.2,93.94 CN2.7 18.21,95.61 v1(18.16,95.66) ; 11.67,86.89 v1(13.97,86.89)
  Bottom Layer w0.254: v1(79.38,76.74) 79.2,76.56 62.1,76.56 61.98,76.43 61.98,72.16 61.47,71.66 v1(54.99,71.66) ; v1(13.97,86.89) 15.99,86.89 17.54,88.43 17.54,95.03 v1(18.16,95.66)
FLASH_CLK: length 32.7
  Top Layer w0.254: J3.5 84.28,52.1 85.98,52.1 89.28,55.4 89.28,66.49 83.44,72.33 R9.1
FLASH_CS: length 24.8
  Top Layer w0.254: 79.38,59.95 81.31,59.95 82.04,59.21 83.23,59.21 83.31,59.29 ; R8.1 v1(81.15,74.79)
  Bottom Layer w0.254: 83.31,59.29 83.23,59.21 82.04,59.21 81.15,60.1 v1(81.15,74.79)
FLASH_MISO: length 19.6
  Top Layer w0.254: J3.3 83.31,56.27 81.77,57.81 R19.2 79.49,56.66 78.23,55.4 75.95,55.4 v1(74.1,53.56) ; U2.6 v1(72.14,48.74)
  Bottom Layer w0.254: v1(74.1,53.56) 72.14,51.59 v1(72.14,48.74)
FLASH_MOSI: length 28.8
  Top Layer w0.254: R10.1 82.42,69.88 86.23,66.07 v1(86.23,54.89)
  Bottom Layer w0.254: J3.6 83.61,48.59 86.23,51.21 v1(86.23,54.89)
USER_3V3_IO0: length 103.7
  Top Layer w0.254: 60.45,6.76 60.45,23.52 59.18,24.79 59.18,39.84 42.98,56.03 36.2,56.03 20.57,71.66 4.44,71.66 2.92,70.13
USER_3V3_IO1: length 99.2
  Top Layer w0.254: 59.18,5.49 59.18,22.38 57.79,23.78 57.79,38.89 42.42,54.26 35.69,54.26 19.81,70.13 5.46,70.13
User_3V3_IO1: length 1.8
  Top Layer w0.254: J4.2 59.18,5.49
USER_3V3_IO2: length 69.9
  Top Layer w0.254: v1(17.22,69.12) 4.44,69.12 2.92,67.59 ; 70.94,71.95 66.76,71.95 v1(66.68,72.04)
  Bottom Layer w0.254: v1(66.68,72.04) 63.75,69.12 v1(17.22,69.12)
USER_3V3_IO3: length 95.1
  Top Layer w0.254: 57.91,6.76 57.91,21.11 56.52,22.51 56.52,37.87 41.91,52.48 35.56,52.48 20.45,67.59 5.46,67.59
USER_3V3_IO4: length 74.9
  Top Layer w0.254: v1(17.98,66.19) 4.06,66.19 2.92,65.05 ; 70.94,73.25 67.49,73.25 v1(67.44,73.31)
  Bottom Layer w0.254: v1(17.98,66.19) 66.17,66.19 67.44,67.46 v1(67.44,73.31)
USER_3V3_IO5: length 95.3
  Top Layer w0.254: 5.46,65.05 5.72,64.8 20.57,64.8 34.16,51.21 41.02,51.21 55.25,36.98 55.25,21.62 56.71,20.16 56.71,5.43 57.91,4.22
USER_3V3_IO6: length 78.3
  Top Layer w0.254: v1(68.33,74.45) 68.43,74.55 70.94,74.55 ; 2.79,62.38 3.94,63.53 v1(19.38,63.53)
  Bottom Layer w0.254: v1(19.38,63.53) 66.17,63.53 68.33,65.69 v1(68.33,74.45)
USER_3V3_IO7: length 89.4
  Top Layer w0.254: 55.37,6.76 55.37,19.33 53.77,20.93 53.77,36.3 40.26,49.81 33.78,49.81 21.21,62.38 5.34,62.38
USER_3V3_IO8: length 95
  Top Layer w0.254: 2.92,59.97 4.44,61.5 20.32,61.5 33.4,48.41 39.12,48.41 52.41,35.12 52.41,20.26 54.1,18.57 54.1,5.49 55.37,4.22
  Bottom Layer w0.254: 54.1,5.49 55.37,4.22
User_3V3_IO8: length 42
  Top Layer w0.254: 79.55,25.77 v1(81.28,25.77)
  Bottom Layer w0.254: v1(81.28,25.77) 78.45,28.6 73.15,28.6 54.1,9.55 54.1,5.49
USER_3V3_IO9: length 115.6
  Top Layer w0.254: 52.83,6.76 52.83,18.32 51.01,20.13 51.01,33.98 37.72,47.27 32.89,47.27 24.64,55.53 23.24,55.53 18.8,59.97 5.46,59.97
  Bottom Layer w0.254: 72.58,29.94 52.83,10.19 52.83,6.76
User_3V3_IO9: length 14.7
  Top Layer w0.254: U3.6 v1(81.28,24.47)
  Bottom Layer w0.254: v1(81.28,24.47) 82.04,25.23 82.04,26.06 78.17,29.94 72.58,29.94
USER_3V3_IO10: length 63.4
  Top Layer w0.254: v1(55.2,51.2) 55.2,52.87 52.29,55.78 v1(51,55.78) ; 2.92,54.89 3.93,55.91 v1(18.79,55.91) ; v1(56.01,47.78) 56.13,47.65 59.95,47.65
  Bottom Layer w0.254: v1(55.2,51.2) 55.2,48.59 v1(56.01,47.78) ; v1(18.79,55.91) 50.87,55.91 v1(51,55.78)
USER_3V3_IO11: length 88.2
  Top Layer w0.254: 5.46,54.89 5.72,54.72 23.04,54.72 32,45.75 36.96,45.75 49.4,33.3 49.4,19.33 51.56,17.17 51.56,5.49
  Bottom Layer w0.254: 52.83,4.22 51.56,5.49 51.56,10.31
User_3V3_IO11: length 49.1
  Top Layer w0.254: J4.8 51.56,5.49 ; U3.8 v1(81.28,23.17)
  Bottom Layer w0.254: 51.56,10.31 72.14,30.89 78.61,30.89 82.68,26.82 82.68,24.56 v1(81.28,23.17)
USER_3V3_IO12: length 114.1
  Top Layer w0.254: 50.29,6.76 50.29,16.41 48.13,18.57 48.13,32.16 36.32,43.97 31.37,43.97 21.46,53.88 4.44,53.88 2.92,52.35
  Bottom Layer w0.254: 49.02,5.49 49.02,2.31 49.91,1.42 61.72,1.42 64.77,4.47 64.77,16.92
User_3V3_IO12: length 27.3
  Top Layer w0.254: 85.29,21.87 v1(82.42,21.87)
  Bottom Layer w0.254: J4.9 49.02,5.49 ; 64.77,16.92 73.28,25.43 74.8,25.43 78.36,21.87 v1(82.42,21.87)
USER_3V3_IO13: length 134.5
  Top Layer w0.254: 50.29,4.22 49.78,4.22 49.11,4.89 49.11,15.18 46.61,17.68 46.61,31.52 35.94,42.19 30.35,42.19 20.19,52.35 5.46,52.35 ; 85.29,23.17 v1(83.54,23.17)
  Bottom Layer w0.254: 50.29,4.22 52.2,2.31 61.09,2.31 63.37,4.6 63.37,17.05 73.53,27.21 74.93,27.21 79.55,22.58 82.96,22.58 v1(83.54,23.17)
USER_3V3_IO14: length 83.4
  Top Layer w0.254: v1(18.54,51.34) 4.44,51.34 2.92,49.81 ; v1(63.09,55.27) 66.04,55.27 69.09,58.32 v1(69.09,64.8) ; v1(69.01,70.64) 70.36,70.64
  Bottom Layer w0.254: v1(18.54,51.34) 22.4,55.2 63.02,55.2 v1(63.09,55.27) ; v1(69.09,64.8) 69.01,64.88 v1(69.01,70.64)
USER_3V3_IO15: length 118.6
  Top Layer w0.254: 5.46,49.81 18.8,49.81 28.45,40.16 34.8,40.16 44.96,30 44.96,16.54 47.75,13.74 47.75,6.76
  Bottom Layer w0.254: 83.57,28.48 80.39,31.65 70.36,31.65 47.75,9.04
User_3V3_IO15: length 8
  Top Layer w0.254: U3.15 v1(83.57,24.47)
  Bottom Layer w0.254: 47.75,9.04 J4.11 ; v1(83.57,24.47) 83.57,28.48
USER_3V3_IO16: length 87.8
  Top Layer w0.254: v1(63.37,75.97) 63.5,75.85 65.2,75.85 65.2,75.85 ; v1(17.15,48.67) 4.31,48.67 2.92,47.27 ; v1(63.5,62.89) v1(63.5,70.04)
  Bottom Layer w0.254: v1(17.15,48.67) 27.05,48.67 32,53.62 62.87,53.62 63.8,54.56 63.8,56.89 63.5,57.19 v1(63.5,62.89) ; v1(63.5,70.04) 62.9,70.65 62.9,75.5 v1(63.37,75.97)
USER_3V3_IO17: length 110.8
  Top Layer w0.254: 47.75,4.22 46.57,5.4 46.57,12.19 43.31,15.46 43.31,29.11 33.66,38.76 26.29,38.76 17.78,47.27 5.46,47.27
  Bottom Layer w0.254: 70.49,34.19 70.49,34.06 46.61,10.19 46.61,7.28 46.57,7.25 46.57,5.4
User_3V3_IO17: length 19.1
  Top Layer w0.254: v1(70.49,34.19) 63.5,41.18 61.34,41.18 59.94,42.58 59.94,46
  Bottom Layer w0.254: J4.12 46.57,5.4
USER_3V3_IO18: length 69.7
  Top Layer w0.254: 45.21,6.76 45.34,6.89 45.34,11.81 41.78,15.36 41.78,28.09 32.64,37.24 25.53,37.24 16.76,46 4.19,46 2.92,44.73
USER_3V3_IO19: length 67
  Top Layer w0.254: 5.46,44.73 15.75,44.73 24.78,35.7 31.64,35.7 40.51,26.82 40.51,14.12 43.85,10.79 43.85,5.58 45.21,4.22
USER_3V3_IO20: length 92.3
  Top Layer w0.254: v1(15.83,43.51) 4.44,43.51 2.92,41.99 ; v1(62.36,52.73) 62.36,58.45 57.55,63.25 57.55,69.56 57.47,69.64 57.47,70.12 57.55,70.2 57.55,71.15 61.59,71.15 62.39,71.95 65.2,71.95
  Bottom Layer w0.254: v1(15.83,43.51) 27.36,43.51 32.58,48.73 47.56,48.73 51.56,52.73 v1(62.36,52.73)
USER_3V3_IO21: length 52.2
  Top Layer w0.254: v1(16.51,41.99) 5.46,41.99
  Bottom Layer w0.254: v1(54.36,49.81) 46.48,41.94 16.51,41.94
User_3V3_IO21: length 4.6
  Top Layer w0.254: R13.2 54.74,50.19 54.36,49.81
USER_3V3_IO22: length 10.4
  Top Layer w0.254: 2.92,39.65 4.19,40.92 v1(12.83,40.92)
USER_3V3_IO23: length 99.3
  Top Layer w0.254: 16.38,40.29 15.75,39.65 5.46,39.65 ; v1(54.61,48.29) 52.83,48.29 47.75,53.37 v1(47.75,61.62) ; 65.2,73.25 61.35,73.25 61.34,73.26 61.01,73.26 60.71,73.56 56.64,73.56 56.39,73.31 56.39,61.75 v1(56.26,61.62)
  Bottom Layer w0.254: v1(47.75,61.62) v1(56.26,61.62) ; v1(16.35,40.29) 46.61,40.29 v1(54.61,48.29)
USER_3V3_IO24: length 117.5
  Top Layer w0.254: v1(67.18,74.58) 67.16,74.55 65.2,74.55 ; v1(17.98,39.12) 17.5,38.64 4.44,38.64 2.92,37.11
  Bottom Layer w0.254: v1(17.98,39.12) 18.03,39.17 51.17,39.17 53.94,41.94 73.15,41.94 75.06,43.84 75.06,74.96 73.91,76.1 67.95,76.1 67.18,75.34 v1(67.18,74.58)
USER_3V3_IO25: length 59.3
  Top Layer w0.254: 42.67,6.76 41.22,8.21 41.22,12.09 39.31,14.01 39.31,25.49 30.48,34.32 24.51,34.32 21.08,37.75 6.1,37.75 5.46,37.11
USER_3V3_IO26: length 61.2
  Top Layer w0.254: v1(40.64,11.08) 38.1,13.62 38.1,24.67 34.52,28.25 16.61,28.25 12.47,32.39 7.49,32.39 6.83,33.05 4.15,33.05 3.14,32.03
  Bottom Layer w0.254: v1(40.64,11.08) 40.64,8.54 41.31,7.87 41.31,5.58 42.67,4.22
USER_3V3_IO27: length 52.9
  Top Layer w0.254: v1(39.17,11.21) 36.83,13.55 36.83,23.65 33.15,27.33 15.4,27.33 11.21,31.52 6.19,31.52 5.68,32.03
  Bottom Layer w0.254: 40.13,6.76 39.88,7.01 39.88,10.5 v1(39.17,11.21)
USER_3V3_IO28: length 159.3
  Top Layer w0.254: 40.13,4.22 40.64,4.22 41.4,4.98 41.4,7.32 35.69,13.04 35.69,22.25 32,25.94 v1(31.12,25.94) 15.24,25.94 10.54,30.63 4.06,30.63 2.92,29.49
  Bottom Layer w0.254: 97.16,76.23 95.85,76.23 90.3,70.67 90.3,53.24 77.38,40.32 54.82,40.32 51.61,37.11 34.93,37.11 31.12,33.31 v1(31.12,25.94)
USER_3V3_IO29: length 135.1
  Top Layer w0.254: 5.46,29.49 10.26,29.49 15.59,24.16 31.62,24.16 ; 31.62,24.16 v1(31.72,24.16) ; 31.62,24.16 34.54,21.24 34.54,12.22 38.77,7.99 38.77,5.4 37.59,4.22
  Bottom Layer w0.254: v1(31.72,24.16) 37.99,30.43 58.34,30.43 66.93,39.02 77.34,39.02 91.82,53.49 91.82,58.18 95.9,62.26 96.39,62.26
USER_3V3_IO30: length 49.5
  Top Layer w0.254: 37.59,6.76 33.53,10.82 33.53,19.71 30.09,23.16 15.03,23.16 9.72,28.48 4.44,28.48 2.92,26.95
USER_3V3_IO31: length 43.2
  Top Layer w0.254: 5.46,26.95 9.66,26.95 14.62,21.98 28.72,21.98 32.51,18.19 32.51,9.3 35.05,6.76
USER_3V3_IO32: length 44.2
  Top Layer w0.254: v1(31.55,9.93) 31.62,10.01 31.62,16.79 27.5,20.92 13.78,20.92 8.76,25.94 4.44,25.94 2.92,24.41
  Bottom Layer w0.254: 29.97,6.76 29.59,7.14 29.59,7.77 31.55,9.73 v1(31.55,9.93)
USER_3V3_IO33: length 38.3
  Top Layer w0.254: 32.51,6.76 30.61,8.66 30.61,15.39 26.26,19.75 12.28,19.75 7.61,24.41 5.46,24.41
USER_3V3_IO34: length 137.2
  Top Layer w0.254: 2.92,21.87 4.44,23.4 6.01,23.4 11.14,18.26 25.58,18.26 29.85,14 29.85,9.99 v1(29.9,9.93)
  Bottom Layer w0.254: 96.39,48.16 95.25,48.16 90.55,43.46 87.25,43.46 81.66,37.87 67.95,37.87 62.48,32.41 62.48,29.87 46.36,13.74 33.71,13.74 v1(29.9,9.93) 27.69,7.72 27.69,2.69 28.19,2.19 34.8,2.19 35.36,2.75 35.36,3.91 35.05,4.22
USER_3V3_IO35: length 60.1
  Top Layer w0.254: v1(79.5,35.33) 84.07,35.33 85.34,34.06 95,34.06 96.39,35.46 ; 32.51,4.22 32.51,2.95 32.26,2.69 ; 10.16,17.17 24.39,17.17 27.31,14.25 27.31,4.22 28.83,2.69
  Bottom Layer w0.254: v1(79.5,35.33) 69.6,35.33
User_3V3_IO35: length 62.1
  Top Layer w0.254: 28.83,2.69 32.26,2.69 ; 5.46,21.87 10.16,17.17
  Bottom Layer w0.254: J4.24 33.78,5.49 33.78,9.04 37.59,12.85 47.12,12.85 69.6,35.33
$1N39: length 2.6
  Top Layer w0.254: 18.3,15.65 D1.1
$1N100: length 5
  Top Layer w0.254: 65.2,71.3 63.4,71.3 61.98,69.88 R3.1
$1N110: length 3.5
  Top Layer w0.254: U2.16 64.76,48.03 63.25,48.03 62.87,47.65 R12.1
$1N121: length 4.8
  Top Layer w0.254: R13.1 61.98,50.19 62.78,49.39 U2.14
$1N153: length 5.5
  Top Layer w0.254: R9.2 76.07,72.6 U1.5
$1N155: length 4.7
  Top Layer w0.254: R5.1 62.65,74.79 63.54,73.9 65.2,73.9
$1N157: length 5.7
  Top Layer w0.254: 65.2,75.2 65.14,75.14 62.81,75.14 62.8,75.14 62.17,75.14 60.82,76.49 R6.1
$1N159: length 4.4
  Top Layer w0.254: 65.2,72.6 60.88,72.6 R4.1
$1N162: length 6
  Top Layer w0.254: U1.9 72.51,75.2 74.04,76.74 76.08,76.74 R7.2
$1N164: length 5.8
  Top Layer w0.254: U1.7 73.75,73.9 74.68,74.83 76.29,74.83 R8.2
$1N165: length 6
  Top Layer w0.254: R10.2 74.91,71.3 U1.3
$1N253: length 3
  Top Layer w0.254: D2.1 R20.1

## Copper pours and planes (outline as drawn; the poured copper is in the pictures)
3V3 on Top Layer: 63.5,45.75 65.92,45.75 65.92,42.57 63.5,42.57
3V3 on Top Layer: 69.34,14.76 79.63,14.76 79.63,5.23 69.34,5.23
3V3 on Top Layer: 84.2,29.49 89.28,29.49 89.28,27.13 84.2,27.13
3V3 on Top Layer: 8.76,88.04 10.67,88.04 10.67,83.02 10.32,82.67 8.92,82.67 8.76,82.83
3V3 on Top Layer: 76.71,52.48 81.66,52.48 81.66,50.19 76.71,50.19
3V3 on Top Layer: 25.02,95.02 28.07,95.02 28.07,87.66 25.02,87.66
GND on Top Layer: -12.83,103.91 108.84,103.91 108.84,-10 -12.83,-10
GND on Bottom Layer: -10.29,105.95 103.38,105.95 103.38,-9.75 -10.29,-9.75

## Text on the board
Top Silkscreen Layer: 5V | GND | BUSY | RST | DC | CS | CLK | DIN | 0805-10uF | 0603-100K | 0603-1K | 0603-100nF | 0603-20R | PWR | MISO | MOSI | 3V3 | IO34 | IO0 | IO35 | IO1 | IO28 | IO29 | IDC-40Pin | 2*13Pin | IO32 | IO33 | IO31 | IO30 | IO27 | IO25 | IO26 | IO18 | IO19 | IO15 | IO17 | IO12 | IO13 | IO9 | IO11 | IO7 | IO8 | IO3 | IO5 | 1 | 0603-5.1K | 接上跳线帽关闭缓存 | 一般不需要接跳线帽 | Flash模块 | 墨水屏
